# Altium project Hexapod_Board.PrjPcb (part 1 of 2)
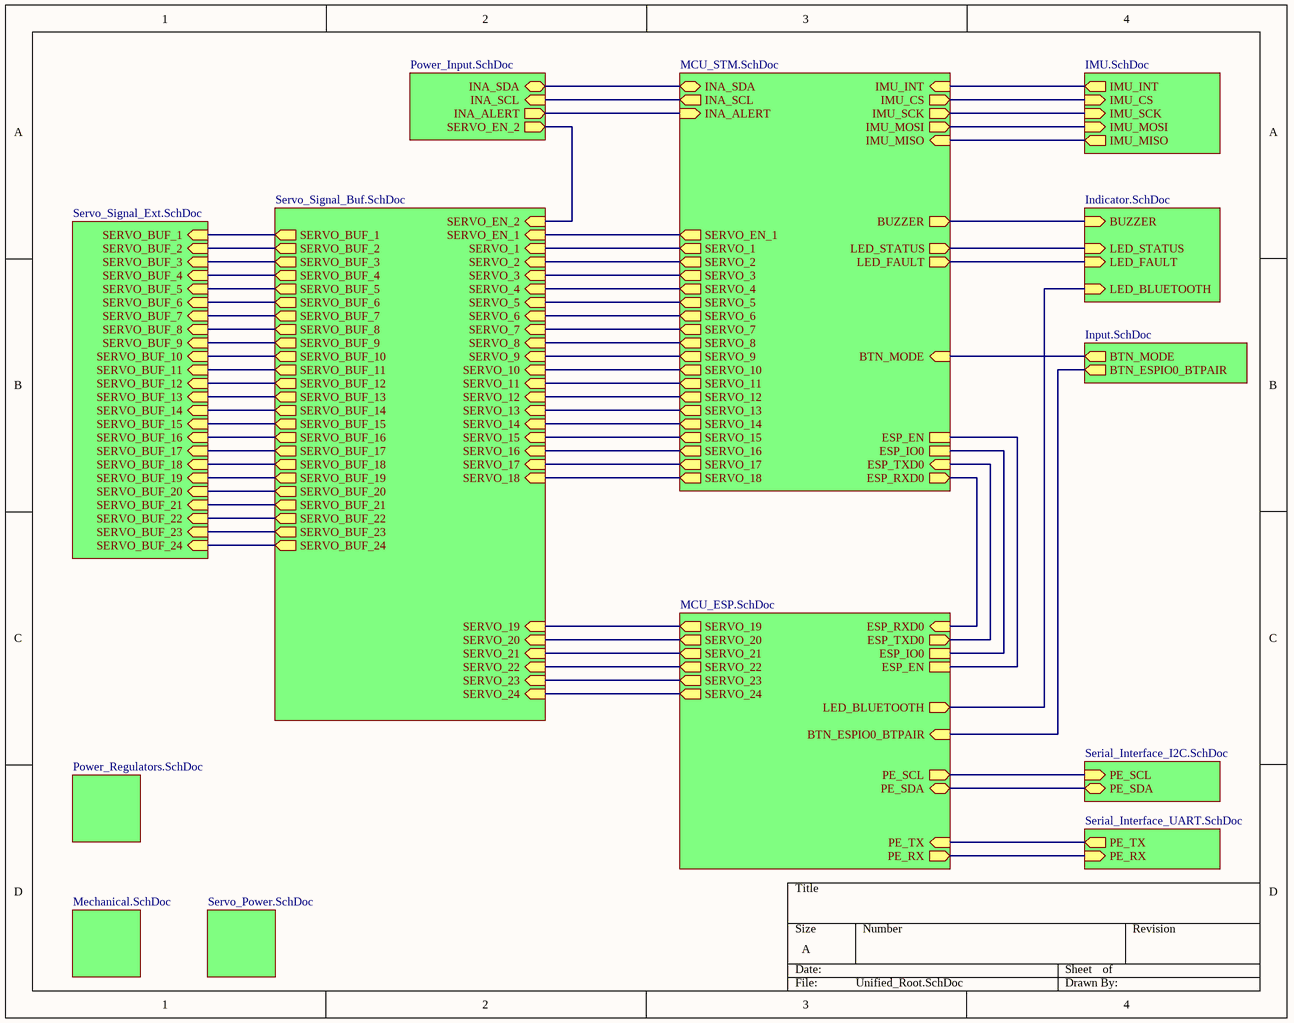
[diagram p0: Unified_Root.SchDoc]
14 sheets, 251 parts. Net scope: hierarchical (ports join the sheet entries above them; power ports are global).
Board file: Hexapod_PCB.PcbDoc
Sheets:
  Unified_Root.SchDoc
    U_MCU_STM = MCU_STM.SchDoc
    U_Indicator = Indicator.SchDoc
    U_Serial_Interface_I2C = Serial_Interface_I2C.SchDoc
    U_Servo_Signal_Buf = Servo_Signal_Buf.SchDoc
    U_Input = Input.SchDoc
    U_Mechanical = Mechanical.SchDoc
    U_MCU_ESP = MCU_ESP.SchDoc
    U_IMU = IMU.SchDoc
    U_Power_Input = Power_Input.SchDoc
    U_Servo_Power = Servo_Power.SchDoc
    U_Power_Regulators = Power_Regulators.SchDoc
    U_Servo_Signal_Ext = Servo_Signal_Ext.SchDoc
    U_Serial_Interface_UART = Serial_Interface_UART.SchDoc

## Sheet Unified_Root.SchDoc
size A; DocumentNumber: 4; SheetNumber: 1; SheetTotal: 14

### Sub-sheets
U_IMU = IMU.SchDoc: IMU_INT (out), IMU_CS (in), IMU_SCK (in), IMU_MOSI (in), IMU_MISO (out)
U_Indicator = Indicator.SchDoc: LED_STATUS (in), LED_FAULT (in), LED_BLUETOOTH (in), BUZZER (in)
U_Input = Input.SchDoc: BTN_ESPIO0_BTPAIR (out), BTN_MODE (out)
U_MCU_ESP = MCU_ESP.SchDoc: SERVO_19 (out), SERVO_20 (out), SERVO_21 (out), SERVO_22 (out), SERVO_23 (out), SERVO_24 (out), ESP_RXD0 (in), ESP_TXD0 (out), ESP_IO0, ESP_EN, PE_SCL (out), PE_SDA (bidir), PE_RX (out), PE_TX (in), BTN_ESPIO0_BTPAIR (in), LED_BLUETOOTH (out)
U_MCU_STM = MCU_STM.SchDoc: SERVO_1 (out), SERVO_2 (out), SERVO_3 (out), SERVO_4 (out), SERVO_5 (out), SERVO_6 (out), SERVO_7 (out), SERVO_8 (out), SERVO_9 (out), SERVO_10 (out), SERVO_11 (out), SERVO_12 (out), SERVO_13 (out), SERVO_14 (out), SERVO_15 (out), SERVO_16 (out), SERVO_17 (out), SERVO_18 (out), SERVO_EN_1 (out), INA_SDA (bidir), INA_SCL (out), INA_ALERT (in), IMU_INT (in), IMU_CS (out), IMU_SCK (out), IMU_MISO (in), IMU_MOSI (out), ESP_IO0, ESP_EN, ESP_RXD0 (out), ESP_TXD0 (in), BUZZER (out), LED_STATUS (out), LED_FAULT (out), BTN_MODE (in)
U_Mechanical = Mechanical.SchDoc: no entries
U_Power_Input = Power_Input.SchDoc: SERVO_EN_2 (out), INA_SCL (in), INA_ALERT (out), INA_SDA (bidir)
U_Power_Regulators = Power_Regulators.SchDoc: no entries
U_Serial_Interface_I2C = Serial_Interface_I2C.SchDoc: PE_SCL (in), PE_SDA (bidir)
U_Serial_Interface_UART = Serial_Interface_UART.SchDoc: PE_TX (out), PE_RX (in)
U_Servo_Power = Servo_Power.SchDoc: no entries
U_Servo_Signal_Buf = Servo_Signal_Buf.SchDoc: SERVO_1 (in), SERVO_2 (in), SERVO_3 (in), SERVO_4 (in), SERVO_5 (in), SERVO_6 (in), SERVO_7 (in), SERVO_8 (in), SERVO_9 (in), SERVO_10 (in), SERVO_11 (in), SERVO_12 (in), SERVO_13 (in), SERVO_14 (in), SERVO_15 (in), SERVO_16 (in), SERVO_17 (in), SERVO_18 (in), SERVO_EN_2 (in), SERVO_EN_1 (in), SERVO_BUF_1 (out), SERVO_BUF_2 (out), SERVO_BUF_3 (out), SERVO_BUF_4 (out), SERVO_BUF_5 (out), SERVO_BUF_6 (out), SERVO_BUF_7 (out), SERVO_BUF_8 (out), SERVO_BUF_9 (out), SERVO_BUF_10 (out), SERVO_BUF_11 (out), SERVO_BUF_12 (out), SERVO_BUF_13 (out), SERVO_BUF_14 (out), SERVO_BUF_15 (out), SERVO_BUF_16 (out), SERVO_BUF_17 (out), SERVO_BUF_18 (out), SERVO_BUF_19 (out), SERVO_BUF_20 (out), SERVO_BUF_21 (out), SERVO_BUF_22 (out), SERVO_BUF_23 (out), SERVO_BUF_24 (out), SERVO_24 (in), SERVO_23 (in), SERVO_22 (in), SERVO_21 (in), SERVO_20 (in), SERVO_19 (in)
U_Servo_Signal_Ext = Servo_Signal_Ext.SchDoc: SERVO_BUF_1 (in), SERVO_BUF_2 (in), SERVO_BUF_3 (in), SERVO_BUF_4 (in), SERVO_BUF_5 (in), SERVO_BUF_6 (in), SERVO_BUF_7 (in), SERVO_BUF_8 (in), SERVO_BUF_9 (in), SERVO_BUF_10 (in), SERVO_BUF_11 (in), SERVO_BUF_12 (in), SERVO_BUF_13 (in), SERVO_BUF_14 (in), SERVO_BUF_15 (in), SERVO_BUF_16 (in), SERVO_BUF_17 (in), SERVO_BUF_18 (in), SERVO_BUF_19 (in), SERVO_BUF_20 (in), SERVO_BUF_21 (in), SERVO_BUF_22 (in), SERVO_BUF_23 (in), SERVO_BUF_24 (in)

### Nets
IO0: sheet U_Input/BTN_ESPIO0_BTPAIR, sheet U_MCU_ESP/BTN_ESPIO0_BTPAIR
NetC78_2: sheet U_MCU_STM/BTN_MODE, sheet U_Input/BTN_MODE
NetD5_1: sheet U_MCU_STM/LED_STATUS, sheet U_Indicator/LED_STATUS
NetD6_1: sheet U_MCU_STM/LED_FAULT, sheet U_Indicator/LED_FAULT
NetD7_1: sheet U_Indicator/LED_BLUETOOTH, sheet U_MCU_ESP/LED_BLUETOOTH
NetR6_1: sheet U_MCU_STM/INA_SCL, sheet U_Power_Input/INA_SCL
NetR7_1: sheet U_MCU_STM/INA_SDA, sheet U_Power_Input/INA_SDA
NetR9_1: sheet U_Servo_Signal_Buf/SERVO_EN_2, sheet U_Power_Input/SERVO_EN_2
NetR11_2: sheet U_MCU_STM/INA_ALERT, sheet U_Power_Input/INA_ALERT
NetR29_2: sheet U_MCU_STM/ESP_EN, sheet U_MCU_ESP/ESP_EN
NetR30_1: sheet U_MCU_STM/ESP_IO0, sheet U_MCU_ESP/ESP_IO0
NetR31_2: sheet U_MCU_STM/ESP_TXD0, sheet U_MCU_ESP/ESP_TXD0
NetR32_2: sheet U_MCU_STM/ESP_RXD0, sheet U_MCU_ESP/ESP_RXD0
NetR35_2: sheet U_Servo_Signal_Buf/SERVO_BUF_6, sheet U_Servo_Signal_Ext/SERVO_BUF_6
NetR36_2: sheet U_Servo_Signal_Buf/SERVO_BUF_3, sheet U_Servo_Signal_Ext/SERVO_BUF_3
NetR37_2: sheet U_Servo_Signal_Buf/SERVO_BUF_7, sheet U_Servo_Signal_Ext/SERVO_BUF_7
NetR38_2: sheet U_Servo_Signal_Buf/SERVO_BUF_4, sheet U_Servo_Signal_Ext/SERVO_BUF_4
NetR39_2: sheet U_Servo_Signal_Buf/SERVO_BUF_8, sheet U_Servo_Signal_Ext/SERVO_BUF_8
NetR40_2: sheet U_Servo_Signal_Buf/SERVO_BUF_5, sheet U_Servo_Signal_Ext/SERVO_BUF_5
NetR41_2: sheet U_Servo_Signal_Buf/SERVO_BUF_16, sheet U_Servo_Signal_Ext/SERVO_BUF_16
NetR42_2: sheet U_Servo_Signal_Buf/SERVO_BUF_13, sheet U_Servo_Signal_Ext/SERVO_BUF_13
NetR43_2: sheet U_Servo_Signal_Buf/SERVO_BUF_1, sheet U_Servo_Signal_Ext/SERVO_BUF_1
NetR44_2: sheet U_Servo_Signal_Buf/SERVO_BUF_14, sheet U_Servo_Signal_Ext/SERVO_BUF_14
NetR45_2: sheet U_Servo_Signal_Buf/SERVO_BUF_2, sheet U_Servo_Signal_Ext/SERVO_BUF_2
NetR46_2: sheet U_Servo_Signal_Buf/SERVO_BUF_15, sheet U_Servo_Signal_Ext/SERVO_BUF_15
NetR47_2: sheet U_Servo_Signal_Buf/SERVO_BUF_10, sheet U_Servo_Signal_Ext/SERVO_BUF_10
NetR48_2: sheet U_Servo_Signal_Buf/SERVO_BUF_17, sheet U_Servo_Signal_Ext/SERVO_BUF_17
NetR49_2: sheet U_Servo_Signal_Buf/SERVO_BUF_11, sheet U_Servo_Signal_Ext/SERVO_BUF_11
NetR50_2: sheet U_Servo_Signal_Buf/SERVO_BUF_18, sheet U_Servo_Signal_Ext/SERVO_BUF_18
NetR51_2: sheet U_Servo_Signal_Buf/SERVO_BUF_12, sheet U_Servo_Signal_Ext/SERVO_BUF_12
NetR52_2: sheet U_Servo_Signal_Buf/SERVO_BUF_19, sheet U_Servo_Signal_Ext/SERVO_BUF_19
NetR53_2: sheet U_Servo_Signal_Buf/SERVO_BUF_20, sheet U_Servo_Signal_Ext/SERVO_BUF_20
NetR54_2: sheet U_Servo_Signal_Buf/SERVO_BUF_23, sheet U_Servo_Signal_Ext/SERVO_BUF_23
NetR55_2: sheet U_Servo_Signal_Buf/SERVO_BUF_21, sheet U_Servo_Signal_Ext/SERVO_BUF_21
NetR56_2: sheet U_Servo_Signal_Buf/SERVO_BUF_24, sheet U_Servo_Signal_Ext/SERVO_BUF_24
NetR57_2: sheet U_Servo_Signal_Buf/SERVO_BUF_22, sheet U_Servo_Signal_Ext/SERVO_BUF_22
NetR58_2: sheet U_Servo_Signal_Buf/SERVO_BUF_9, sheet U_Servo_Signal_Ext/SERVO_BUF_9
NetR78_2: sheet U_MCU_STM/BUZZER, sheet U_Indicator/BUZZER
NetSW4_1: sheet U_MCU_STM/SERVO_EN_1, sheet U_Servo_Signal_Buf/SERVO_EN_1
NetU5_14: sheet U_MCU_STM/SERVO_18, sheet U_Servo_Signal_Buf/SERVO_18
NetU5_15: sheet U_MCU_STM/SERVO_17, sheet U_Servo_Signal_Buf/SERVO_17
NetU5_17: sheet U_MCU_STM/SERVO_16, sheet U_Servo_Signal_Buf/SERVO_16
NetU5_20: sheet U_MCU_STM/IMU_CS, sheet U_IMU/IMU_CS
NetU5_21: sheet U_MCU_STM/IMU_SCK, sheet U_IMU/IMU_SCK
NetU5_22: sheet U_MCU_STM/IMU_MISO, sheet U_IMU/IMU_MISO
NetU5_23: sheet U_MCU_STM/IMU_MOSI, sheet U_IMU/IMU_MOSI
NetU5_24: sheet U_MCU_STM/IMU_INT, sheet U_IMU/IMU_INT
NetU5_26: sheet U_MCU_STM/SERVO_15, sheet U_Servo_Signal_Buf/SERVO_15
NetU5_27: sheet U_MCU_STM/SERVO_14, sheet U_Servo_Signal_Buf/SERVO_14
NetU5_29: sheet U_MCU_STM/SERVO_13, sheet U_Servo_Signal_Buf/SERVO_13
NetU5_41: sheet U_MCU_STM/SERVO_1, sheet U_Servo_Signal_Buf/SERVO_1
NetU5_42: sheet U_MCU_STM/SERVO_2, sheet U_Servo_Signal_Buf/SERVO_2
NetU5_43: sheet U_MCU_STM/SERVO_3, sheet U_Servo_Signal_Buf/SERVO_3
NetU5_44: sheet U_MCU_STM/SERVO_4, sheet U_Servo_Signal_Buf/SERVO_4
NetU5_50: sheet U_MCU_STM/SERVO_5, sheet U_Servo_Signal_Buf/SERVO_5
NetU5_55: sheet U_MCU_STM/SERVO_6, sheet U_Servo_Signal_Buf/SERVO_6
NetU5_56: sheet U_MCU_STM/SERVO_7, sheet U_Servo_Signal_Buf/SERVO_7
NetU5_57: sheet U_MCU_STM/SERVO_8, sheet U_Servo_Signal_Buf/SERVO_8
NetU5_58: sheet U_MCU_STM/SERVO_9, sheet U_Servo_Signal_Buf/SERVO_9
NetU5_59: sheet U_MCU_STM/SERVO_10, sheet U_Servo_Signal_Buf/SERVO_10
NetU5_61: sheet U_MCU_STM/SERVO_11, sheet U_Servo_Signal_Buf/SERVO_11
NetU5_62: sheet U_MCU_STM/SERVO_12, sheet U_Servo_Signal_Buf/SERVO_12
NetU7_11: sheet U_Serial_Interface_I2C/PE_SCL, sheet U_MCU_ESP/PE_SCL
NetU7_12: sheet U_Serial_Interface_I2C/PE_SDA, sheet U_MCU_ESP/PE_SDA
NetU7_13: sheet U_MCU_ESP/PE_TX, sheet U_Serial_Interface_UART/PE_TX
NetU7_14: sheet U_MCU_ESP/PE_RX, sheet U_Serial_Interface_UART/PE_RX
NetU7_26: sheet U_Servo_Signal_Buf/SERVO_19, sheet U_MCU_ESP/SERVO_19
NetU7_27: sheet U_Servo_Signal_Buf/SERVO_20, sheet U_MCU_ESP/SERVO_20
NetU7_28: sheet U_Servo_Signal_Buf/SERVO_21, sheet U_MCU_ESP/SERVO_21
NetU7_29: sheet U_Servo_Signal_Buf/SERVO_22, sheet U_MCU_ESP/SERVO_22
NetU7_30: sheet U_Servo_Signal_Buf/SERVO_23, sheet U_MCU_ESP/SERVO_23
NetU7_31: sheet U_Servo_Signal_Buf/SERVO_24, sheet U_MCU_ESP/SERVO_24

## Sheet MCU_STM.SchDoc
size A; DocumentNumber: 3; SheetNumber: 4; SheetTotal: 14
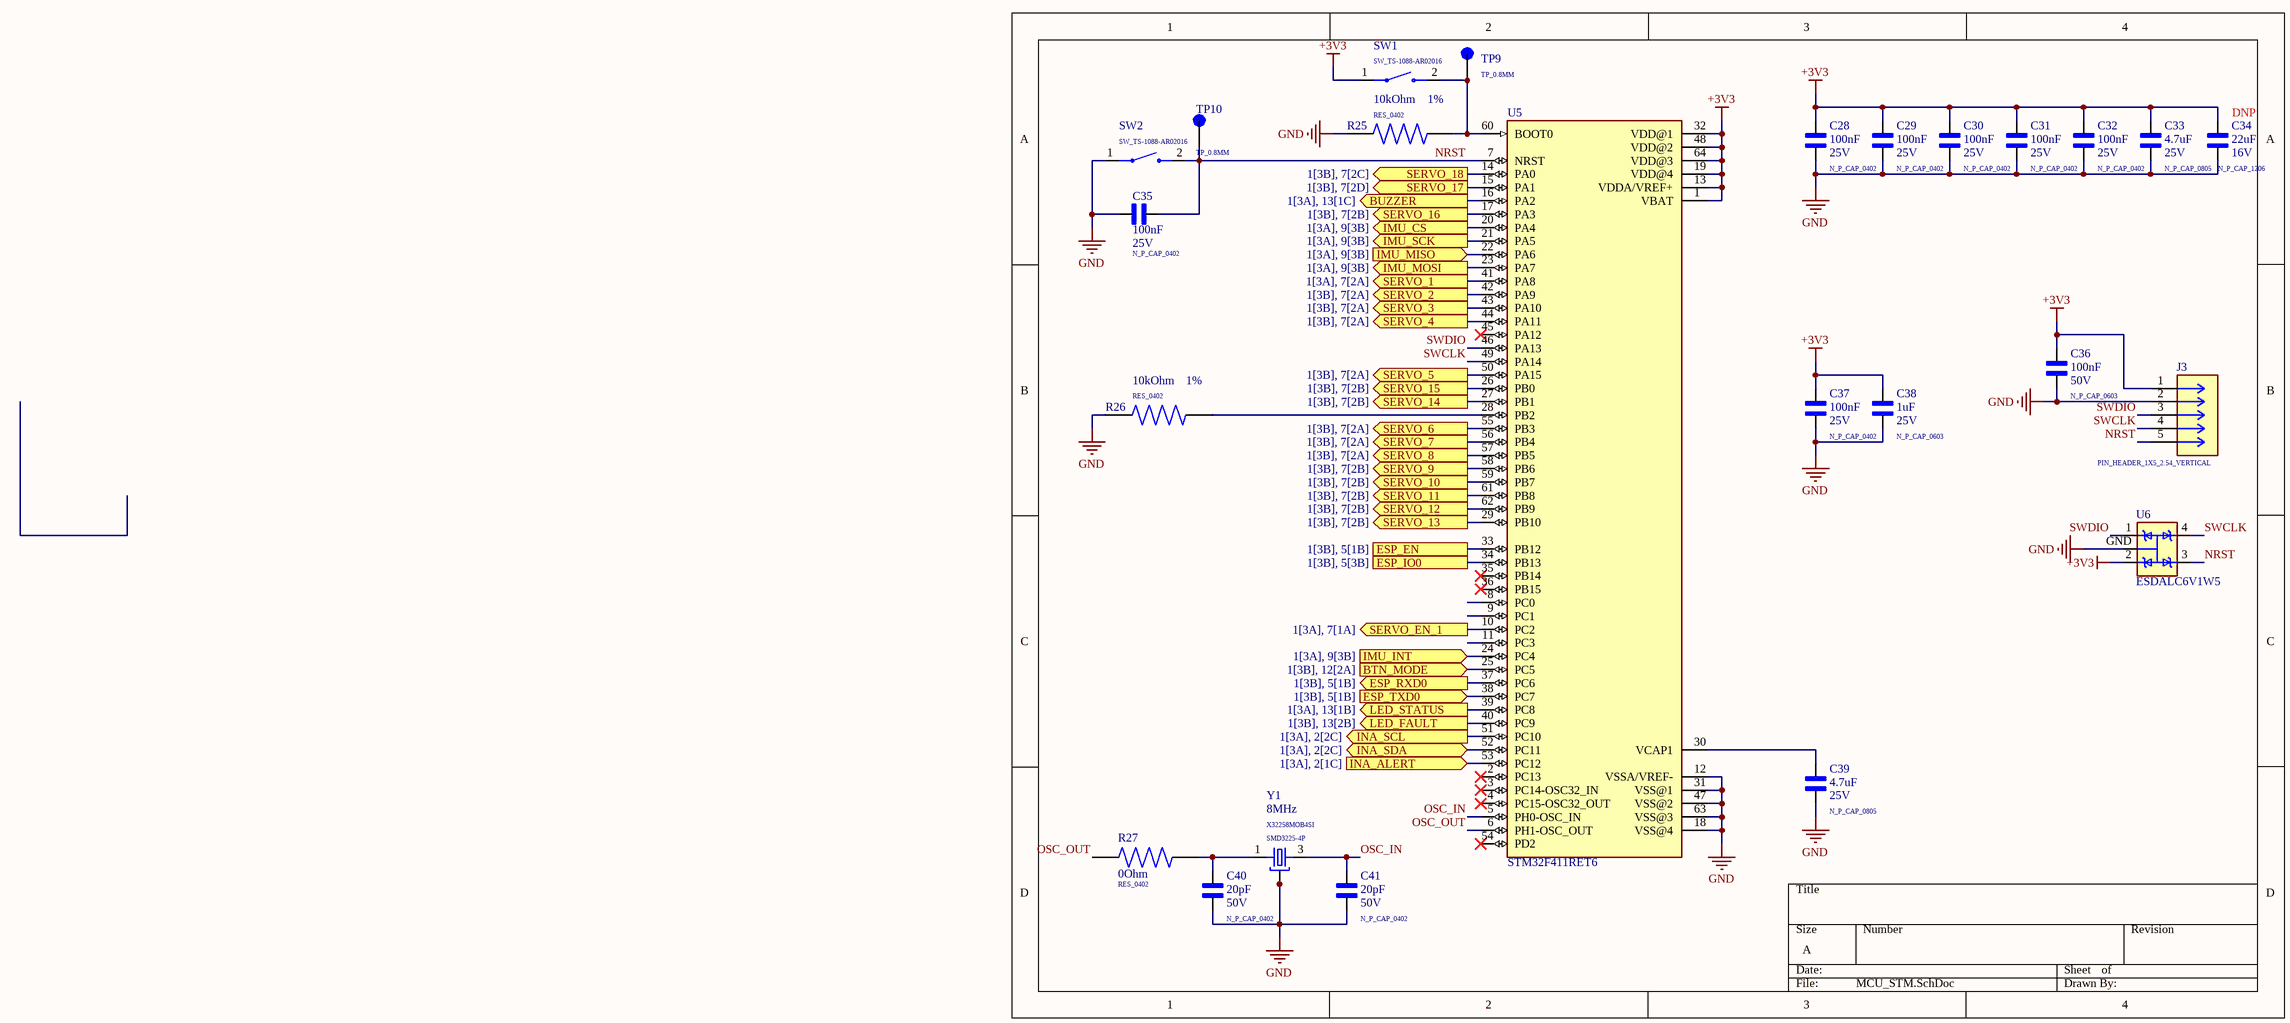
[diagram p1: MCU_STM.SchDoc]

### Parts
C28  N_P_CAP_0402  value 100nF  Rated Voltage: 25V  [N_P_CAP_0402]
C29  N_P_CAP_0402  value 100nF  Rated Voltage: 25V  [N_P_CAP_0402]
C30  N_P_CAP_0402  value 100nF  Rated Voltage: 25V  [N_P_CAP_0402]
C31  N_P_CAP_0402  value 100nF  Rated Voltage: 25V  [N_P_CAP_0402]
C32  N_P_CAP_0402  value 100nF  Rated Voltage: 25V  [N_P_CAP_0402]
C33  N_P_CAP_0805  value 4.7uF  Rated Voltage: 25V  [N_P_CAP_0805]
C34  N_P_CAP_1206  value 22uF  Rated Voltage: 16V  [N_P_CAP_1206]
C35  N_P_CAP_0402  value 100nF  Rated Voltage: 25V  [N_P_CAP_0402]
C36  N_P_CAP_0603  value 100nF  Rated Voltage: 50V  [N_P_CAP_0603]
C37  N_P_CAP_0402  value 100nF  Rated Voltage: 25V  [N_P_CAP_0402]
C38  N_P_CAP_0603  value 1uF  Rated Voltage: 25V  [N_P_CAP_0603]
C39  N_P_CAP_0805  value 4.7uF  Rated Voltage: 25V  [N_P_CAP_0805]
C40  N_P_CAP_0402  value 20pF  Rated Voltage: 50V  [N_P_CAP_0402]
C41  N_P_CAP_0402  value 20pF  Rated Voltage: 50V  [N_P_CAP_0402]
J3  PIN_HEADER_1X5_2.54_VERTICAL  [PIN_HEADER_1X5_2.54_VERTICAL]
R25  RES_0402  value 10kOhm  Tolerance: 1%  [RES_0402]
R26  RES_0402  value 10kOhm  Tolerance: 1%  [RES_0402]
R27  RES_0402  value 0Ohm  [RES_0402]
SW1  SW_TS-1088-AR02016  [SW_TS-1088-AR02016]
SW2  SW_TS-1088-AR02016  [SW_TS-1088-AR02016]
TP9  TP_0.8MM  [TP_0.8MM]
TP10  TP_0.8MM  [TP_0.8MM]
U5  STM32F411RET6  [QFP50P1200X1200X160-64N]
U6  ESDALC6V1W5  [SOT323-5L]
Y1  SMD3225-4P  Frequency: 8MHz  MPN: X32258MOB4SI  [SMD3225-4P]

### Ports
BTN_MODE (in, see 1[3B], 12[2A]), BUZZER (out, see 1[3A], 13[1C]), ESP_EN (see 1[3B], 5[1B]), ESP_IO0 (see 1[3B], 5[3B]), ESP_RXD0 (out, see 1[3B], 5[1B]), ESP_TXD0 (in, see 1[3B], 5[1B]), IMU_CS (out, see 1[3A], 9[3B]), IMU_INT (in, see 1[3A], 9[3B]), IMU_MISO (in, see 1[3A], 9[3B]), IMU_MOSI (out, see 1[3A], 9[3B]), IMU_SCK (out, see 1[3A], 9[3B]), INA_ALERT (in, see 1[3A], 2[1C]), INA_SCL (out, see 1[3A], 2[2C]), INA_SDA (bidir, see 1[3A], 2[2C]), LED_FAULT (out, see 1[3B], 13[2B]), LED_STATUS (out, see 1[3A], 13[1B]), SERVO_1 (out, see 1[3A], 7[2A]), SERVO_2 (out, see 1[3B], 7[2A]), SERVO_3 (out, see 1[3B], 7[2A]), SERVO_4 (out, see 1[3B], 7[2A]), SERVO_5 (out, see 1[3B], 7[2A]), SERVO_6 (out, see 1[3B], 7[2A]), SERVO_7 (out, see 1[3B], 7[2A]), SERVO_8 (out, see 1[3B], 7[2A]), SERVO_9 (out, see 1[3B], 7[2B]), SERVO_10 (out, see 1[3B], 7[2B]), SERVO_11 (out, see 1[3B], 7[2B]), SERVO_12 (out, see 1[3B], 7[2B]), SERVO_13 (out, see 1[3B], 7[2B]), SERVO_14 (out, see 1[3B], 7[2B]), SERVO_15 (out, see 1[3B], 7[2B]), SERVO_16 (out, see 1[3B], 7[2B]), SERVO_17 (out, see 1[3B], 7[2D]), SERVO_18 (out, see 1[3B], 7[2C]), SERVO_EN_1 (out, see 1[3A], 7[1A])

### Nets
+3V3: C28.2 C29.2 C30.2 C31.2 C32.2 C33.2 C34.2 C36.2 C37.2 C38.2 J3.1 SW1.1 U5.1(VBAT) U5.13(VDDA/VREF+) U5.19(VDD@4) U5.32(VDD@1) U5.48(VDD@2) U5.64(VDD@3) U6.2(I/02)
GND: C28.1 C29.1 C30.1 C31.1 C32.1 C33.1 C34.1 C35.1 C36.1 C37.1 C38.1 C39.1 C40.1 C41.1 J3.2 R25.2 R26.2 SW2.1 U5.12(VSSA/VREF-) U5.18(VSS@4) U5.31(VSS@1) U5.47(VSS@2) U5.63(VSS@3) U6.GND Y1.2(GND) Y1.4(GND)
NRST: C35.2 J3.5 SW2.2 TP10.TP U5.7(NRST) U6.3(I/03)
OSC_IN: C41.2 U5.5(PH0-OSC_IN) Y1.3
OSC_OUT: R27.2 U5.6(PH1-OSC_OUT)
SWCLK: J3.4 U5.49(PA14) U6.4(I/04)
SWDIO: J3.3 U5.46(PA13) U6.1(I/01)
NetC39_2: C39.2 U5.30(VCAP1)
NetC40_2: C40.2 R27.1 Y1.1
NetC78_2: U5.25(PC5) ; port BTN_MODE
NetD5_1: U5.39(PC8) ; port LED_STATUS
NetD6_1: U5.40(PC9) ; port LED_FAULT
NetR6_1: U5.51(PC10) ; port INA_SCL
NetR7_1: U5.52(PC11) ; port INA_SDA
NetR11_2: U5.53(PC12) ; port INA_ALERT
NetR25_1: R25.1 SW1.2 TP9.TP U5.60(BOOT0)
NetR26_1: R26.1 U5.28(PB2)
NetR29_2: U5.33(PB12) ; port ESP_EN
NetR30_1: U5.34(PB13) ; port ESP_IO0
NetR31_2: U5.38(PC7) ; port ESP_TXD0
NetR32_2: U5.37(PC6) ; port ESP_RXD0
NetR78_2: U5.16(PA2) ; port BUZZER
NetSW4_1: U5.10(PC2) ; port SERVO_EN_1
NetU5_14: U5.14(PA0) ; port SERVO_18
NetU5_15: U5.15(PA1) ; port SERVO_17
NetU5_17: U5.17(PA3) ; port SERVO_16
NetU5_20: U5.20(PA4) ; port IMU_CS
NetU5_21: U5.21(PA5) ; port IMU_SCK
NetU5_22: U5.22(PA6) ; port IMU_MISO
NetU5_23: U5.23(PA7) ; port IMU_MOSI
NetU5_24: U5.24(PC4) ; port IMU_INT
NetU5_26: U5.26(PB0) ; port SERVO_15
NetU5_27: U5.27(PB1) ; port SERVO_14
NetU5_29: U5.29(PB10) ; port SERVO_13
NetU5_41: U5.41(PA8) ; port SERVO_1
NetU5_42: U5.42(PA9) ; port SERVO_2
NetU5_43: U5.43(PA10) ; port SERVO_3
NetU5_44: U5.44(PA11) ; port SERVO_4
NetU5_50: U5.50(PA15) ; port SERVO_5
NetU5_55: U5.55(PB3) ; port SERVO_6
NetU5_56: U5.56(PB4) ; port SERVO_7
NetU5_57: U5.57(PB5) ; port SERVO_8
NetU5_58: U5.58(PB6) ; port SERVO_9
NetU5_59: U5.59(PB7) ; port SERVO_10
NetU5_61: U5.61(PB8) ; port SERVO_11
NetU5_62: U5.62(PB9) ; port SERVO_12

Not connected (* = marked no-connect by the designer): U5 2(PC13)* 3(PC14-OSC32_IN)* 4(PC15-OSC32_OUT)* 8(PC0) 9(PC1) 11(PC3) 35(PB14)* 36(PB15)* 45(PA12)* 54(PD2)*

### Notes on the sheet
- (near C34) DNP

### Library data of the parts
C28-C32 C35 C37 = N_P_CAP: GENERIC NON-POLARIZED CAP; Temperature Coefficient: X7R; LCSC Part Number: C105883; Tolerance: *; MF: *; ESR: *; MPN: *
C33 C36 C38 C39 = N_P_CAP: GENERIC NON-POLARIZED CAP; Tolerance: *; MF: *; ESR: *; MPN: *; Temperature Coefficient: *
  C33 C39: LCSC Part Number: C354262
  C36: LCSC Part Number: C106221
  C38: LCSC Part Number: C106858
C34 = N_P_CAP: GENERIC NON-POLARIZED CAP; MPN: CL31A226KOHNNNE; Tolerance: 10%; LCSC Part Number: C90146; MF: *; ESR: *; Temperature Coefficient: *
C40 C41 = N_P_CAP: GENERIC NON-POLARIZED CAP; Temperature Coefficient: NP0; LCSC Part Number: C107000; Tolerance: *; MF: *; ESR: *; MPN: *
J3 = PIN_HEADER_5P: GENERIC PIN HEADER 5P; MF: *; MPN: *; LCSC Part Number: *
R25 R26 = RES: GENERIC RES; Power Rating: *; MPN: *; Rated Voltage: *; Temperature Coefficient: *; LCSC Part Number: C60490
R27 = RES: GENERIC RES; Tolerance: 1%; Power Rating: *; MPN: *; Rated Voltage: *; Temperature Coefficient: *; LCSC Part Number: C106231
SW1 SW2 = TACTILE_SWITCH_NO_SPST_2P: GENERIC TACTILE SWITCH NO SPST 2P; MF: *; MPN: *; LCSC Part Number: *
TP9 TP10 = TEST_POINT: GENERIC TEST POINT; MF: *; MPN: *
U5 = STM32F411RET6: ARM Cortex-M4 STM32F4 Microcontroller IC 32-Bit 100MHz 512KB (512K x 8) FLASH 64-LQFP (10x10); MF: STMicroelectronics; Package: LQFP-64 STMicroelectronics; MPN: STM32F411RET6; LCSC Part Number: C94355
U6 = ESDALC6V1W5: Clamp Ipp Tvs Diode Surface Mount SOT-323-5; MF: STMicroelectronics; Package: SOT-323 STMicroelectronics; MPN: ESDALC6V1W5; LCSC Part Number: C703691
Y1 = XTAL_4P: GENERIC PASSIVE CRYSTAL; MF: YXC Crystal Oscillators; ESR: *; LCSC Part Number: C2682775; Load Capacitance: *; Frequency Tolerance: *

## Sheet Indicator.SchDoc
size A; DocumentNumber: 13; SheetNumber: 13; SheetTotal: 14
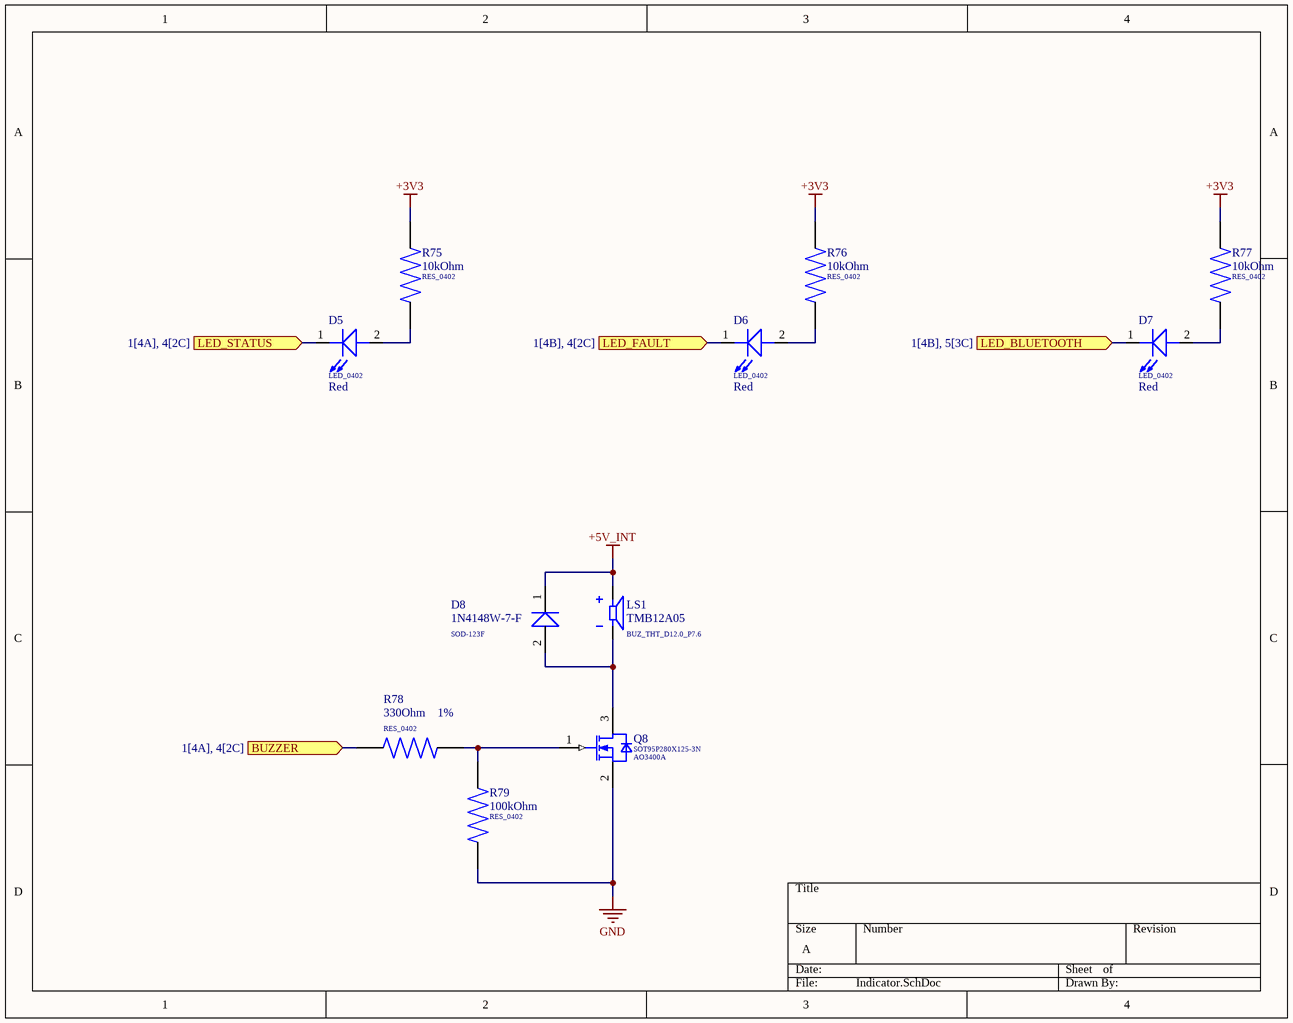
[diagram p2: Indicator.SchDoc]

### Parts
D5  LED_0402  Color: Red  [LED_0402]
D6  LED_0402  Color: Red  [LED_0402]
D7  LED_0402  Color: Red  [LED_0402]
D8  SOD-123F  MPN: 1N4148W-7-F  [SOD-123F]
LS1  BUZ_THT_D12.0_P7.6  MPN: TMB12A05  [BUZ_THT_D12.0_P7.6]
Q8  SOT95P280X125-3N  MPN: AO3400A  [SOT95P280X125-3N]
R75  RES_0402  value 10kOhm  [RES_0402]
R76  RES_0402  value 10kOhm  [RES_0402]
R77  RES_0402  value 10kOhm  [RES_0402]
R78  RES_0402  value 330Ohm  Tolerance: 1%  [RES_0402]
R79  RES_0402  value 100kOhm  [RES_0402]

### Ports
BUZZER (in, see 1[4A], 4[2C]), LED_BLUETOOTH (in, see 1[4B], 5[3C]), LED_FAULT (in, see 1[4B], 4[2C]), LED_STATUS (in, see 1[4A], 4[2C])

### Nets
+3V3: R75.1 R76.1 R77.1
+5V_INT: D8.1(K) LS1.P
GND: Q8.2(SOURCE) R79.1
NetD5_1: D5.1(K) ; port LED_STATUS
NetD5_2: D5.2(A) R75.2
NetD6_1: D6.1(K) ; port LED_FAULT
NetD6_2: D6.2(A) R76.2
NetD7_1: D7.1(K) ; port LED_BLUETOOTH
NetD7_2: D7.2(A) R77.2
NetD8_2: D8.2(A) LS1.N Q8.3(DRAIN)
NetQ8_1: Q8.1(GATE) R78.1 R79.2
NetR78_2: R78.2 ; port BUZZER

### Library data of the parts
D5-D7 = LED: GENERIC LED; MPN: *; Vf (Typ): *; Package: *; LCSC Part Number: C25503345; If (Max): *; MF: *
D8 = DIODE: GENERIC DIODE; Pd (Max): *; LCSC Part Number: C83528; Vf (Max): *; If (Avg): *; Vr (Max): *; MF: *
LS1 = BUZZER: GENERIC BUZZER; SPL: 85dB; MF: *; Type: Active Buzzer; LCSC Part Number: C96093
Q8 = NMOS_GSD: GENERIC N-MOSFET 1=G, 2=S, 3=D; Channel Type: P-Channel; LCSC Part Number: C20917; Vds (Max): *; Id (Max): *; Vgs(th): *; MF: *; Rds(on) (Max): *
R75-R77 R79 = RES: GENERIC RES; Tolerance: 1%; Power Rating: *; MPN: *; Rated Voltage: *; Temperature Coefficient: *
  R75-R77: LCSC Part Number: C60490
  R79: LCSC Part Number: C60491
R78 = RES: GENERIC RES; MPN: RC0402FR-07330RL; Power Rating: *; Rated Voltage: *; Temperature Coefficient: *; LCSC Part Number: C105875

## Sheet Serial_Interface_I2C.SchDoc
size A; DocumentNumber: 10; SheetNumber: 10; SheetTotal: 14
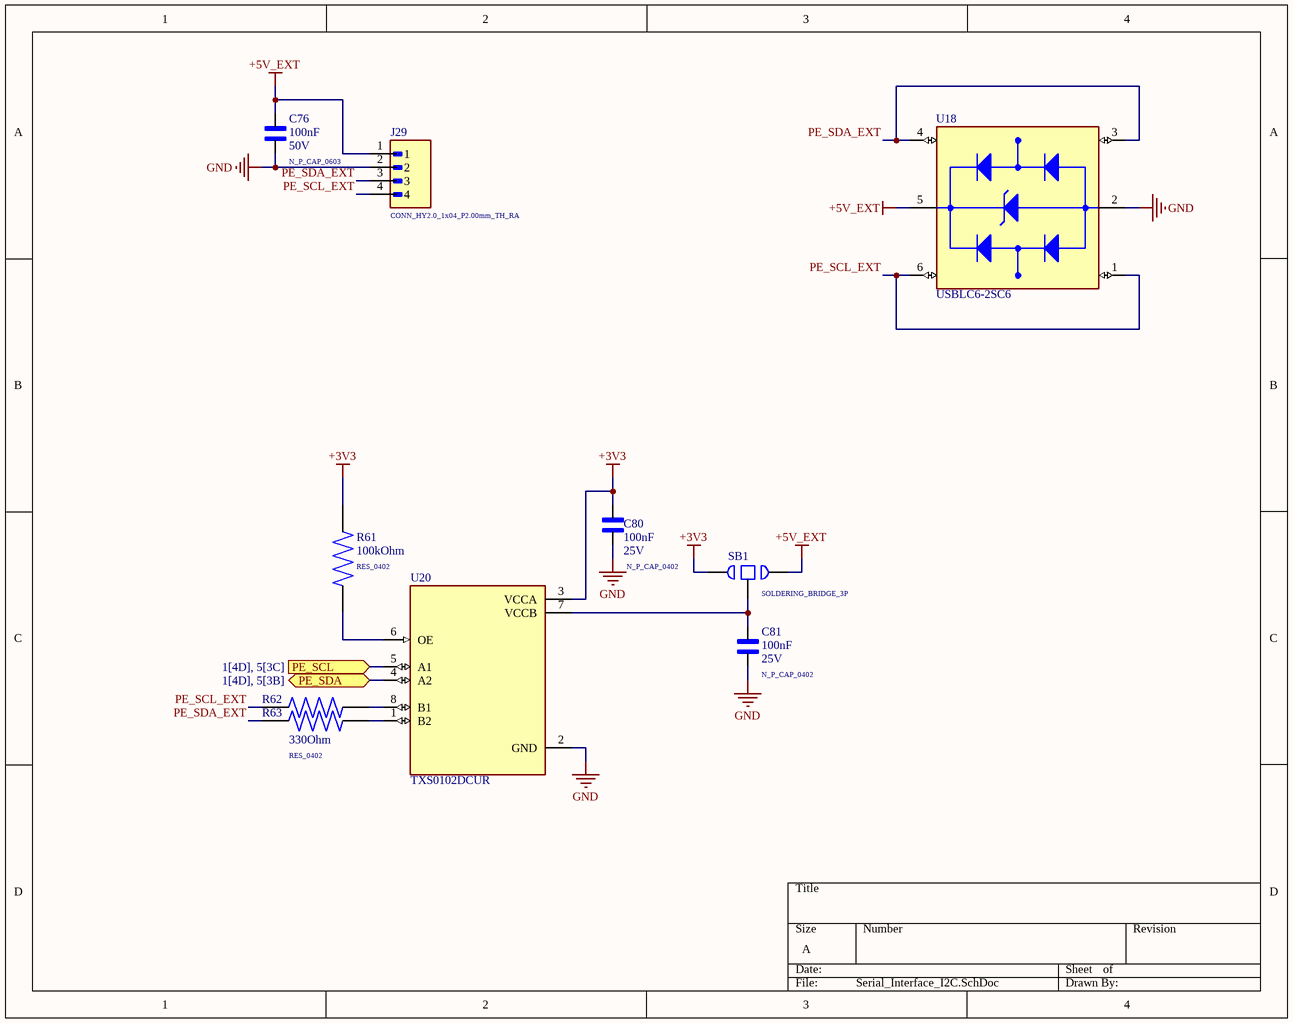
[diagram p3: Serial_Interface_I2C.SchDoc]

### Parts
C76  N_P_CAP_0603  value 100nF  Rated Voltage: 50V  [N_P_CAP_0603]
C80  N_P_CAP_0402  value 100nF  Rated Voltage: 25V  [N_P_CAP_0402]
C81  N_P_CAP_0402  value 100nF  Rated Voltage: 25V  [N_P_CAP_0402]
J29  CONN_HY2.0_1x04_P2.00mm_TH_RA  [CONN_HY2.0_1x04_P2.00mm_TH_RA]
R61  RES_0402  value 100kOhm  [RES_0402]
R62  RES_0402  [RES_0402]  (value not drawn)
R63  RES_0402  value 330Ohm  [RES_0402]
SB1  SOLDERING_BRIDGE_3P  [SOLDERING_BRIDGE_3P]  (no BOM)
U18  USBLC6-2SC6  [SOT95P280X145-6N]
U20  TXS0102DCUR  [SOP50P310X90-8N]

### Ports
PE_SCL (in, see 1[4D], 5[3C]), PE_SDA (bidir, see 1[4D], 5[3B])

### Nets
+3V3: C80.2 R61.1 SB1.1 U20.3(VCCA)
+5V_EXT: C76.2 J29.1 SB1.2 U18.5(VBUS)
GND: C76.1 C80.1 C81.1 J29.2 U18.2(GND) U20.2(GND)
PE_SCL_EXT: J29.4 R62.2 U18.1(I/O1_IN) U18.6(I/O1_OUT)
PE_SDA_EXT: J29.3 R63.1 U18.3(I/O2_IN) U18.4(I/O2_OUT)
NetC81_2: C81.2 SB1.3 U20.7(VCCB)
NetR61_2: R61.2 U20.6(OE)
NetR62_1: R62.1 U20.8(B1)
NetR63_2: R63.2 U20.1(B2)
NetU7_11: U20.5(A1) ; port PE_SCL
NetU7_12: U20.4(A2) ; port PE_SDA

### Library data of the parts
C76 = N_P_CAP: GENERIC NON-POLARIZED CAP; LCSC Part Number: C106221; Tolerance: *; MF: *; ESR: *; MPN: *; Temperature Coefficient: *
C80 C81 = N_P_CAP: as C28 on sheet MCU_STM; LCSC Part Number: C105883; Tolerance: *; MF: *; ESR: *; MPN: *
J29 = CONN_4P: GENERIC CONNECTOR 4P; MF: *; MPN: *; LCSC Part Number: C55381784
R61 = RES: GENERIC RES; Tolerance: 1%; Power Rating: *; MPN: *; Rated Voltage: *; Temperature Coefficient: *; LCSC Part Number: C60491
R62 = RES: GENERIC RES; MPN: RC0402FR-07330RL; Tolerance: 1%; Value: 330Ohm; Power Rating: *; Rated Voltage: *; Temperature Coefficient: *; LCSC Part Number: C105875
R63 = RES: GENERIC RES; MPN: RC0402FR-07330RL; Tolerance: 1%; Power Rating: *; Rated Voltage: *; Temperature Coefficient: *; LCSC Part Number: C105875
SB1 = SOLDERING_BRIDGE_3P: GENERIC SOLDERING BRIDGE 3P
U18 = USBLC6-2SC6: 17V Clamp 5A (8/20Âµs) Ipp Tvs Diode Surface Mount SOT-23-6; MF: STMicroelectronics; Package: SOT-23-6 STMicroelectronics; MPN: USBLC6-2SC6; LCSC Part Number: C7519
U20 = TXS0102DCUR: 2-Bit Bidirectional Voltage-Level Shifter for Open-Drain and Push-Pull Application; MF: Texas Instruments; Package: VSSOP-8 Texas Instruments; MPN: TXS0102DCUR

## Sheet Servo_Signal_Buf.SchDoc
size A; DocumentNumber: 7; SheetNumber: 7; SheetTotal: 14
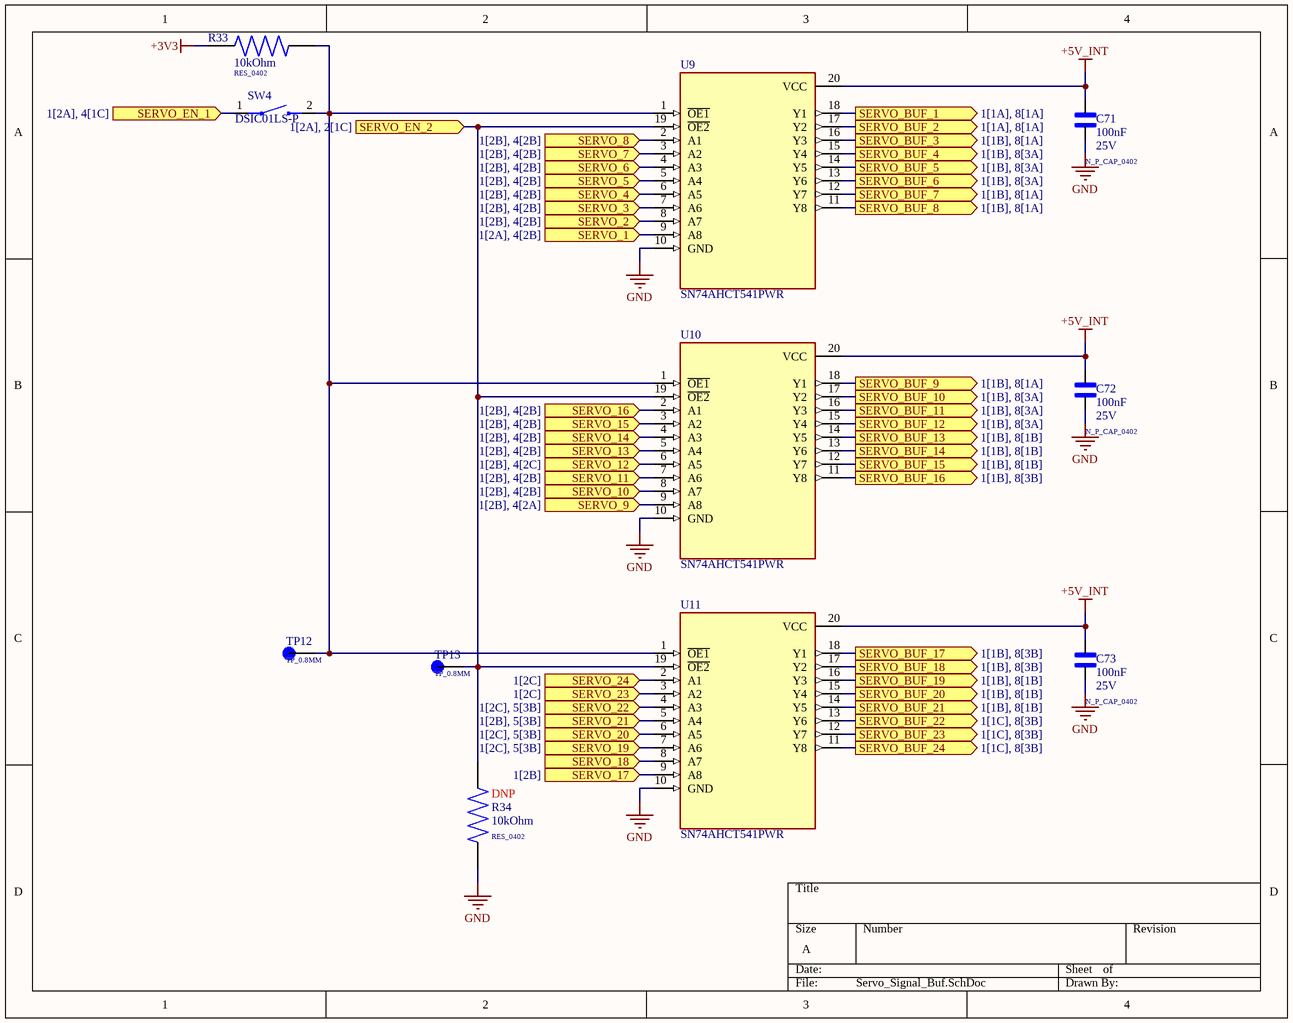
[diagram p4: Servo_Signal_Buf.SchDoc]

### Parts
C71  N_P_CAP_0402  value 100nF  Rated Voltage: 25V  [N_P_CAP_0402]
C72  N_P_CAP_0402  value 100nF  Rated Voltage: 25V  [N_P_CAP_0402]
C73  N_P_CAP_0402  value 100nF  Rated Voltage: 25V  [N_P_CAP_0402]
R33  RES_0402  value 10kOhm  [RES_0402]
R34  RES_0402  value 10kOhm  [RES_0402]
SW4  MPN: DSIC01LS-P  [SW_KAE01SGGT]  (hidden comment: SW_KAE01SGGT)
TP12  TP_0.8MM  [TP_0.8MM]
TP13  TP_0.8MM  [TP_0.8MM]
U9  SN74AHCT541PWR  [SOP65P640X120-20N]
U10  SN74AHCT541PWR  [SOP65P640X120-20N]
U11  SN74AHCT541PWR  [SOP65P640X120-20N]

### Ports
SERVO_1 (in, see 1[2A], 4[2B]), SERVO_2 (in, see 1[2B], 4[2B]), SERVO_3 (in, see 1[2B], 4[2B]), SERVO_4 (in, see 1[2B], 4[2B]), SERVO_5 (in, see 1[2B], 4[2B]), SERVO_6 (in, see 1[2B], 4[2B]), SERVO_7 (in, see 1[2B], 4[2B]), SERVO_8 (in, see 1[2B], 4[2B]), SERVO_9 (in, see 1[2B], 4[2A]), SERVO_10 (in, see 1[2B], 4[2B]), SERVO_11 (in, see 1[2B], 4[2B]), SERVO_12 (in, see 1[2B], 4[2C]), SERVO_13 (in, see 1[2B], 4[2B]), SERVO_14 (in, see 1[2B], 4[2B]), SERVO_15 (in, see 1[2B], 4[2B]), SERVO_16 (in, see 1[2B], 4[2B]), SERVO_17 (in, see 1[2B]), SERVO_18 (in), SERVO_19 (in, see 1[2C], 5[3B]), SERVO_20 (in, see 1[2C], 5[3B]), SERVO_21 (in, see 1[2B], 5[3B]), SERVO_22 (in, see 1[2C], 5[3B]), SERVO_23 (in, see 1[2C]), SERVO_24 (in, see 1[2C]), SERVO_BUF_1 (out, see 1[1A], 8[1A]), SERVO_BUF_2 (out, see 1[1A], 8[1A]), SERVO_BUF_3 (out, see 1[1B], 8[1A]), SERVO_BUF_4 (out, see 1[1B], 8[3A]), SERVO_BUF_5 (out, see 1[1B], 8[3A]), SERVO_BUF_6 (out, see 1[1B], 8[3A]), SERVO_BUF_7 (out, see 1[1B], 8[1A]), SERVO_BUF_8 (out, see 1[1B], 8[1A]), SERVO_BUF_9 (out, see 1[1B], 8[1A]), SERVO_BUF_10 (out, see 1[1B], 8[3A]), SERVO_BUF_11 (out, see 1[1B], 8[3A]), SERVO_BUF_12 (out, see 1[1B], 8[3A]), SERVO_BUF_13 (out, see 1[1B], 8[1B]), SERVO_BUF_14 (out, see 1[1B], 8[1B]), SERVO_BUF_15 (out, see 1[1B], 8[1B]), SERVO_BUF_16 (out, see 1[1B], 8[3B]), SERVO_BUF_17 (out, see 1[1B], 8[3B]), SERVO_BUF_18 (out, see 1[1B], 8[3B]), SERVO_BUF_19 (out, see 1[1B], 8[1B]), SERVO_BUF_20 (out, see 1[1B], 8[1B]), SERVO_BUF_21 (out, see 1[1B], 8[1B]), SERVO_BUF_22 (out, see 1[1C], 8[3B]), SERVO_BUF_23 (out, see 1[1C], 8[3B]), SERVO_BUF_24 (out, see 1[1C], 8[3B]), SERVO_EN_1 (in, see 1[2A], 4[1C]), SERVO_EN_2 (in, see 1[2A], 2[1C])

### Nets
+3V3: R33.1
+5V_INT: C71.2 C72.2 C73.2 U9.20(VCC) U10.20(VCC) U11.20(VCC)
GND: C71.1 C72.1 C73.1 R34.2 U9.10(GND) U10.10(GND) U11.10(GND)
NetR9_1: R34.1 TP13.TP U9.19(~{OE2}) U10.19(~{OE2}) U11.19(~{OE2}) ; port SERVO_EN_2
NetR33_2: R33.2 SW4.2 TP12.TP U9.1(~{OE1}) U10.1(~{OE1}) U11.1(~{OE1})
NetR35_2: U9.13(Y6) ; port SERVO_BUF_6
NetR36_2: U9.16(Y3) ; port SERVO_BUF_3
NetR37_2: U9.12(Y7) ; port SERVO_BUF_7
NetR38_2: U9.15(Y4) ; port SERVO_BUF_4
NetR39_2: U9.11(Y8) ; port SERVO_BUF_8
NetR40_2: U9.14(Y5) ; port SERVO_BUF_5
NetR41_2: U10.11(Y8) ; port SERVO_BUF_16
NetR42_2: U10.14(Y5) ; port SERVO_BUF_13
NetR43_2: U9.18(Y1) ; port SERVO_BUF_1
NetR44_2: U10.13(Y6) ; port SERVO_BUF_14
NetR45_2: U9.17(Y2) ; port SERVO_BUF_2
NetR46_2: U10.12(Y7) ; port SERVO_BUF_15
NetR47_2: U10.17(Y2) ; port SERVO_BUF_10
NetR48_2: U11.18(Y1) ; port SERVO_BUF_17
NetR49_2: U10.16(Y3) ; port SERVO_BUF_11
NetR50_2: U11.17(Y2) ; port SERVO_BUF_18
NetR51_2: U10.15(Y4) ; port SERVO_BUF_12
NetR52_2: U11.16(Y3) ; port SERVO_BUF_19
NetR53_2: U11.15(Y4) ; port SERVO_BUF_20
NetR54_2: U11.12(Y7) ; port SERVO_BUF_23
NetR55_2: U11.14(Y5) ; port SERVO_BUF_21
NetR56_2: U11.11(Y8) ; port SERVO_BUF_24
NetR57_2: U11.13(Y6) ; port SERVO_BUF_22
NetR58_2: U10.18(Y1) ; port SERVO_BUF_9
NetSW4_1: SW4.1 ; port SERVO_EN_1
NetU5_14: U11.8(A7) ; port SERVO_18
NetU5_15: U11.9(A8) ; port SERVO_17
NetU5_17: U10.2(A1) ; port SERVO_16
NetU5_26: U10.3(A2) ; port SERVO_15
NetU5_27: U10.4(A3) ; port SERVO_14
NetU5_29: U10.5(A4) ; port SERVO_13
NetU5_41: U9.9(A8) ; port SERVO_1
NetU5_42: U9.8(A7) ; port SERVO_2
NetU5_43: U9.7(A6) ; port SERVO_3
NetU5_44: U9.6(A5) ; port SERVO_4
NetU5_50: U9.5(A4) ; port SERVO_5
NetU5_55: U9.4(A3) ; port SERVO_6
NetU5_56: U9.3(A2) ; port SERVO_7
NetU5_57: U9.2(A1) ; port SERVO_8
NetU5_58: U10.9(A8) ; port SERVO_9
NetU5_59: U10.8(A7) ; port SERVO_10
NetU5_61: U10.7(A6) ; port SERVO_11
NetU5_62: U10.6(A5) ; port SERVO_12
NetU7_26: U11.7(A6) ; port SERVO_19
NetU7_27: U11.6(A5) ; port SERVO_20
NetU7_28: U11.5(A4) ; port SERVO_21
NetU7_29: U11.4(A3) ; port SERVO_22
NetU7_30: U11.3(A2) ; port SERVO_23
NetU7_31: U11.2(A1) ; port SERVO_24

### Notes on the sheet
- (near R34) DNP

### Library data of the parts
C71-C73 = N_P_CAP: as C28 on sheet MCU_STM; LCSC Part Number: C105883; Tolerance: *; MF: *; ESR: *; MPN: *
R33 R34 = RES: GENERIC RES; Tolerance: 1%; Power Rating: *; MPN: *; Rated Voltage: *; Temperature Coefficient: *; LCSC Part Number: C60490
SW4 = SW_DIP_SPST_1P: GENERIC DIP SWITCH SPST 1 POLE; MF: XKB Connection; LCSC Part Number: C600988
TP12 TP13 = TEST_POINT: GENERIC TEST POINT; MF: *; MPN: *
U9-U11 = SN74AHCT541PWR: Octal Buffers/Drivers With 3-State Outputs 20-TSSOP -40 to 125; MF: Texas Instruments; DigiKey Part Number: 296-1120-1-ND; Package: TSSOP-20 Texas Instruments; MPN: SN74AHCT541PWR; LCSC Part Number: C50989

## Sheet Input.SchDoc
size A; DocumentNumber: 12; SheetNumber: 12; SheetTotal: 14
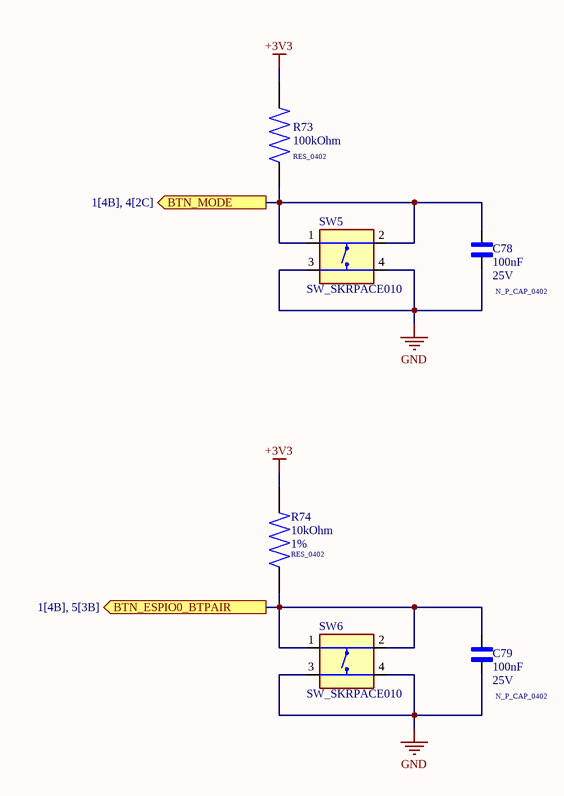
[diagram p5: Input.SchDoc]

### Parts
C78  N_P_CAP_0402  value 100nF  Rated Voltage: 25V  [N_P_CAP_0402]
C79  N_P_CAP_0402  value 100nF  Rated Voltage: 25V  [N_P_CAP_0402]
R73  RES_0402  value 100kOhm  [RES_0402]
R74  RES_0402  value 10kOhm  Tolerance: 1%  [RES_0402]
SW5  SW_SKRPACE010  [SW_SKRPACE010]
SW6  SW_SKRPACE010  [SW_SKRPACE010]

### Ports
BTN_ESPIO0_BTPAIR (out, see 1[4B], 5[3B]), BTN_MODE (out, see 1[4B], 4[2C])

### Nets
+3V3: R73.1 R74.1
GND: C78.1 C79.1 SW5.3 SW5.4 SW6.3 SW6.4
IO0: C79.2 R74.2 SW6.1 SW6.2 ; port BTN_ESPIO0_BTPAIR
NetC78_2: C78.2 R73.2 SW5.1 SW5.2 ; port BTN_MODE

### Library data of the parts
C78 C79 = N_P_CAP: as C28 on sheet MCU_STM; LCSC Part Number: C105883; Tolerance: *; MF: *; ESR: *; MPN: *
R73 = RES: GENERIC RES; Tolerance: 1%; Power Rating: *; MPN: *; Rated Voltage: *; Temperature Coefficient: *; LCSC Part Number: C60491
R74 = RES: GENERIC RES; Power Rating: *; MPN: *; Rated Voltage: *; Temperature Coefficient: *; LCSC Part Number: C60490
SW5 SW6 = TACTILE_SWITCH_NO_SPST_4P: GENERIC TACTILE SWITCH NO SPST 4P; MF: ALPS; MPN: SKRPACE010; LCSC Part Number: C139797

## Sheet Mechanical.SchDoc
size A; DocumentNumber: 14; SheetNumber: 14; SheetTotal: 14
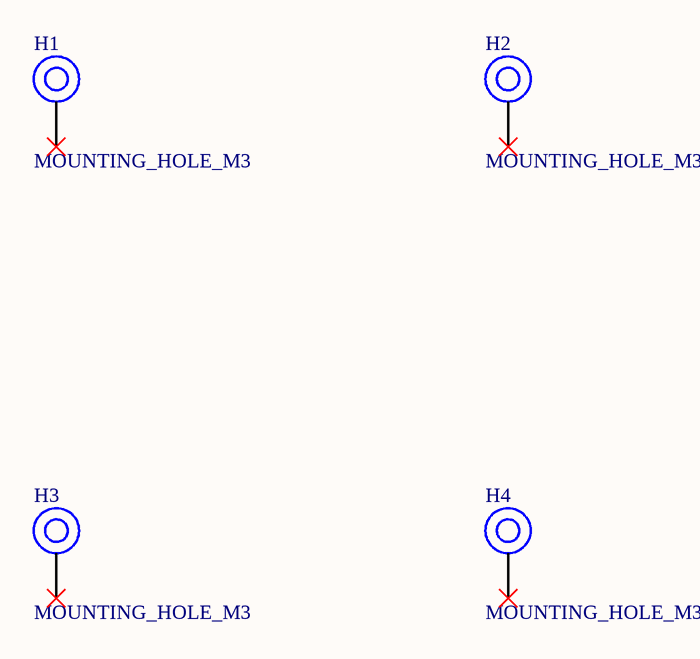
[diagram p6: Mechanical.SchDoc]

### Parts
H1  MOUNTING_HOLE_M3  [MOUNTING_HOLE_M3]  (no BOM)
H2  MOUNTING_HOLE_M3  [MOUNTING_HOLE_M3]  (no BOM)
H3  MOUNTING_HOLE_M3  [MOUNTING_HOLE_M3]  (no BOM)
H4  MOUNTING_HOLE_M3  [MOUNTING_HOLE_M3]  (no BOM)

### Nets

Not connected (* = marked no-connect by the designer): H1 1*; H2 1*; H3 1*; H4 1*

### Library data of the parts
H1-H4 = MOUNTING_HOLE: GENERIC MOUNTING HOLE

## Sheet MCU_ESP.SchDoc
size A; DocumentNumber: 5; SheetNumber: 5; SheetTotal: 14
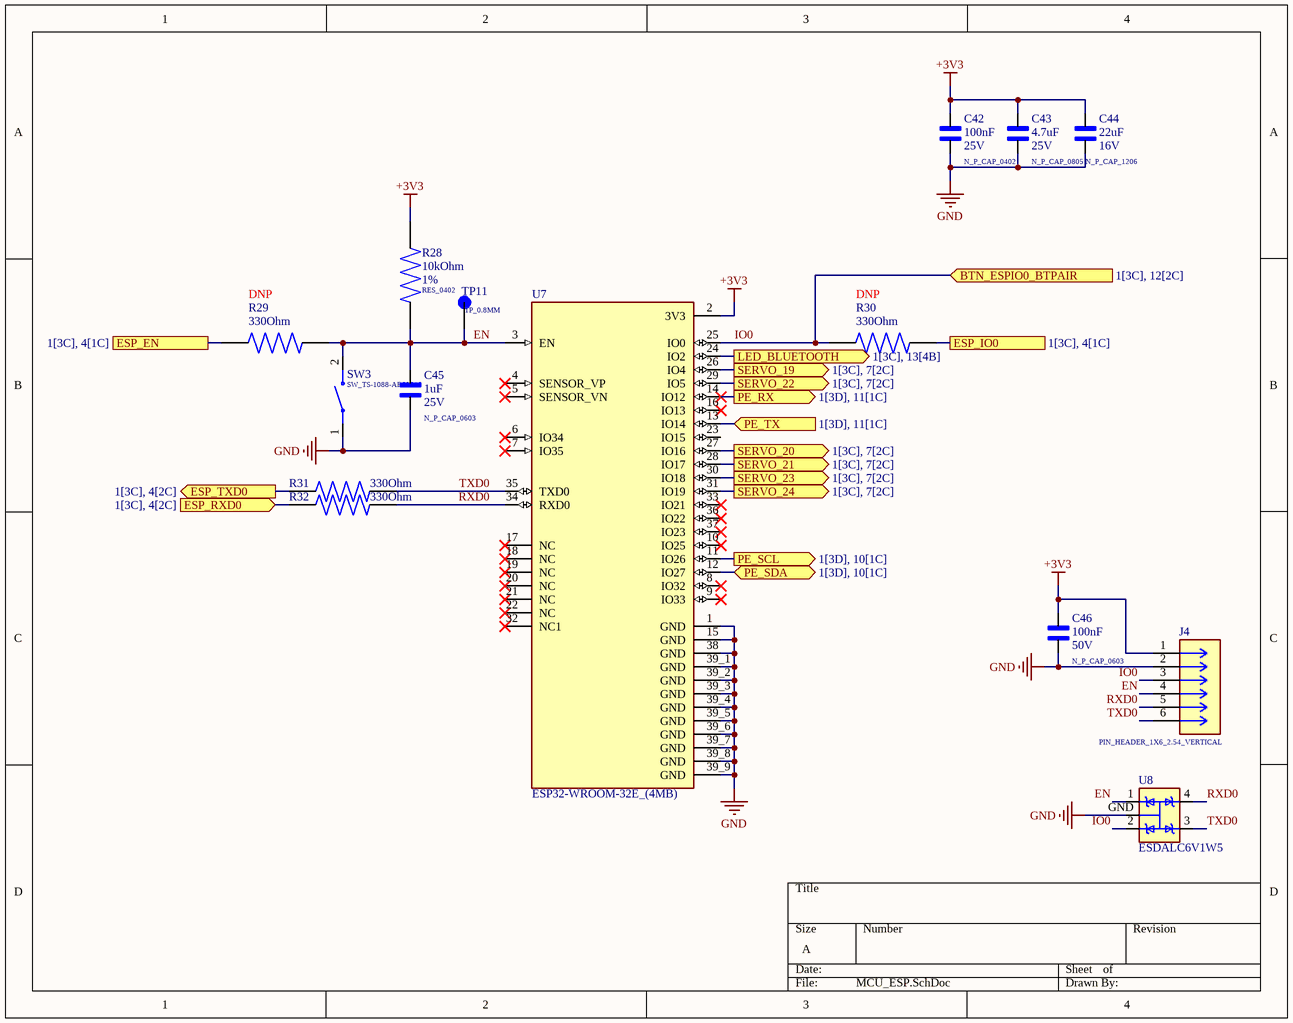
[diagram p7: MCU_ESP.SchDoc]

### Parts
C42  N_P_CAP_0402  value 100nF  Rated Voltage: 25V  [N_P_CAP_0402]
C43  N_P_CAP_0805  value 4.7uF  Rated Voltage: 25V  [N_P_CAP_0805]
C44  N_P_CAP_1206  value 22uF  Rated Voltage: 16V  [N_P_CAP_1206]
C45  N_P_CAP_0603  value 1uF  Rated Voltage: 25V  [N_P_CAP_0603]
C46  N_P_CAP_0603  value 100nF  Rated Voltage: 50V  [N_P_CAP_0603]
J4  PIN_HEADER_1X6_2.54_VERTICAL  [PIN_HEADER_1X6_2.54_VERTICAL]
R28  RES_0402  value 10kOhm  Tolerance: 1%  [RES_0402]
R29  value 330Ohm  [RES_0402]  (hidden comment: RES_0402)
R30  value 330Ohm  [RES_0402]  (hidden comment: RES_0402)
R31  value 330Ohm  [RES_0402]  (hidden comment: RES_0402)
R32  value 330Ohm  [RES_0402]  (hidden comment: RES_0402)
SW3  SW_TS-1088-AR02016  [SW_TS-1088-AR02016]
TP11  TP_0.8MM  [TP_0.8MM]
U7  ESP32-WROOM-32E_(4MB)  [XCVR_ESP32-WROOM-32E_(4MB)]
U8  ESDALC6V1W5  [SOT323-5L]

### Ports
BTN_ESPIO0_BTPAIR (in, see 1[3C], 12[2C]), ESP_EN (see 1[3C], 4[1C]), ESP_IO0 (see 1[3C], 4[1C]), ESP_RXD0 (in, see 1[3C], 4[2C]), ESP_TXD0 (out, see 1[3C], 4[2C]), LED_BLUETOOTH (out, see 1[3C], 13[4B]), PE_RX (out, see 1[3D], 11[1C]), PE_SCL (out, see 1[3D], 10[1C]), PE_SDA (bidir, see 1[3D], 10[1C]), PE_TX (in, see 1[3D], 11[1C]), SERVO_19 (out, see 1[3C], 7[2C]), SERVO_20 (out, see 1[3C], 7[2C]), SERVO_21 (out, see 1[3C], 7[2C]), SERVO_22 (out, see 1[3C], 7[2C]), SERVO_23 (out, see 1[3C], 7[2C]), SERVO_24 (out, see 1[3C], 7[2C])

### Nets
+3V3: C42.2 C43.2 C44.2 C46.2 J4.1 R28.1 U7.2(3V3)
GND: C42.1 C43.1 C44.1 C45.1 C46.1 J4.2 SW3.1 U7.1(GND) U7.15(GND) U7.38(GND) U7.39_1(GND) U7.39_2(GND) U7.39_3(GND) U7.39_4(GND) U7.39_5(GND) U7.39_6(GND) U7.39_7(GND) U7.39_8(GND) U7.39_9(GND) U8.GND
EN: C45.2 J4.4 R28.2 R29.1 SW3.2 TP11.TP U7.3(EN) U8.1(I/01)
IO0: J4.3 R30.2 U7.25(IO0) U8.2(I/02) ; port BTN_ESPIO0_BTPAIR
RXD0: J4.5 R32.1 U7.34(RXD0) U8.4(I/04)
TXD0: J4.6 R31.1 U7.35(TXD0) U8.3(I/03)
NetD7_1: U7.24(IO2) ; port LED_BLUETOOTH
NetR29_2: R29.2 ; port ESP_EN
NetR30_1: R30.1 ; port ESP_IO0
NetR31_2: R31.2 ; port ESP_TXD0
NetR32_2: R32.2 ; port ESP_RXD0
NetU7_11: U7.11(IO26) ; port PE_SCL
NetU7_12: U7.12(IO27) ; port PE_SDA
NetU7_13: U7.13(IO14) ; port PE_TX
NetU7_14: U7.14(IO12) ; port PE_RX
NetU7_26: U7.26(IO4) ; port SERVO_19
NetU7_27: U7.27(IO16) ; port SERVO_20
NetU7_28: U7.28(IO17) ; port SERVO_21
NetU7_29: U7.29(IO5) ; port SERVO_22
NetU7_30: U7.30(IO18) ; port SERVO_23
NetU7_31: U7.31(IO19) ; port SERVO_24

Not connected (* = marked no-connect by the designer): U7 4(SENSOR_VP)* 5(SENSOR_VN)* 6(IO34)* 7(IO35)* 8(IO32)* 9(IO33)* 10(IO25)* 16(IO13)* 17(NC)* 18(NC)* 19(NC)* 20(NC)* 21(NC)* 22(NC)* 23(IO15) 32(NC1)* 33(IO21)* 36(IO22)* 37(IO23)*

### Notes on the sheet
- (near R29) DNP
- (near R30) DNP

### Library data of the parts
C42 = N_P_CAP: as C28 on sheet MCU_STM; LCSC Part Number: C105883; Tolerance: *; MF: *; ESR: *; MPN: *
C43 C45 C46 = N_P_CAP: GENERIC NON-POLARIZED CAP; Tolerance: *; MF: *; ESR: *; MPN: *; Temperature Coefficient: *
  C43: LCSC Part Number: C354262
  C45: LCSC Part Number: C106858
  C46: LCSC Part Number: C106221
C44 = N_P_CAP: as C34 on sheet MCU_STM; LCSC Part Number: C90146; MF: *; ESR: *; Temperature Coefficient: *
J4 = PIN_HEADER_6P: GENERIC PIN HEADER 6P; MF: *; MPN: *; LCSC Part Number: *
R28 = RES: GENERIC RES; Power Rating: *; MPN: *; Rated Voltage: *; Temperature Coefficient: *; LCSC Part Number: C60490
R29-R32 = RES: as R63 on sheet Serial_Interface_I2C; Power Rating: *; Rated Voltage: *; Temperature Coefficient: *; LCSC Part Number: C105875
SW3 = TACTILE_SWITCH_NO_SPST_2P: GENERIC TACTILE SWITCH NO SPST 2P; MF: *; MPN: *; LCSC Part Number: *
TP11 = TEST_POINT: GENERIC TEST POINT; MF: *; MPN: *
U7 = ESP32-WROOM-32E_(4MB): Bluetooth, WiFi 802.11b/g/n, Bluetooth v4.2 +EDR, Class 1, 2 and 3 Transceiver Module 2.4GHz ~ 2.5GHz Integrated, Trace Surface Mount; MPN: ESP32-WROOM-32E (4MB); MF: Espressif Systems; Package: SMD-44 Espressif Systems
U8 = ESDALC6V1W5: as U6 on sheet MCU_STM; Package: SOT-323 STMicroelectronics; MPN: ESDALC6V1W5; LCSC Part Number: C703691

## Sheet IMU.SchDoc
size A; DocumentNumber: 9; SheetNumber: 9; SheetTotal: 14
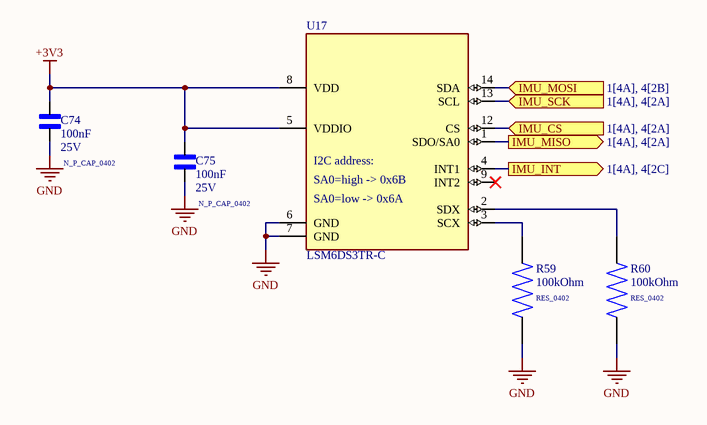
[diagram p8: IMU.SchDoc]

### Parts
C74  N_P_CAP_0402  value 100nF  Rated Voltage: 25V  [N_P_CAP_0402]
C75  N_P_CAP_0402  value 100nF  Rated Voltage: 25V  [N_P_CAP_0402]
R59  RES_0402  value 100kOhm  [RES_0402]
R60  RES_0402  value 100kOhm  [RES_0402]
U17  LSM6DS3TR-C  [LGA-14-2.5X3MM]

### Ports
IMU_CS (in, see 1[4A], 4[2A]), IMU_INT (out, see 1[4A], 4[2C]), IMU_MISO (out, see 1[4A], 4[2A]), IMU_MOSI (in, see 1[4A], 4[2B]), IMU_SCK (in, see 1[4A], 4[2A])

### Nets
+3V3: C74.2 C75.2 U17.5(VDDIO) U17.8(VDD)
GND: C74.1 C75.1 R59.2 R60.2 U17.6(GND) U17.7(GND)
NetR59_1: R59.1 U17.3(SCX)
NetR60_1: R60.1 U17.2(SDX)
NetU5_20: U17.12(CS) ; port IMU_CS
NetU5_21: U17.13(SCL) ; port IMU_SCK
NetU5_22: U17.1(SDO/SA0) ; port IMU_MISO
NetU5_23: U17.14(SDA) ; port IMU_MOSI
NetU5_24: U17.4(INT1) ; port IMU_INT

Not connected (* = marked no-connect by the designer): U17 9(INT2)*

### Notes on the sheet
- (in symbol LSM6DS3TR-C) I2C address:; SA0=high -> 0x6B; SA0=low -> 0x6A

### Library data of the parts
C74 C75 = N_P_CAP: as C28 on sheet MCU_STM; LCSC Part Number: C105883; Tolerance: *; MF: *; ESR: *; MPN: *
R59 R60 = RES: GENERIC RES; Tolerance: 1%; Power Rating: *; MPN: *; Rated Voltage: *; Temperature Coefficient: *; LCSC Part Number: C60491
U17 = LSM6DS3TR-C: IMUs - Inertial Measurement Units iNEMO 6DoF inertial module, for entry level / mid-tier smart phones and Portable PC platforms; MF: STMicroelectronics; MPN: LSM6DS3TR-C; LCSC Part Number: C967633

## Sheet Power_Input.SchDoc
size A; DocumentNumber: 1; SheetNumber: 2; SheetTotal: 14
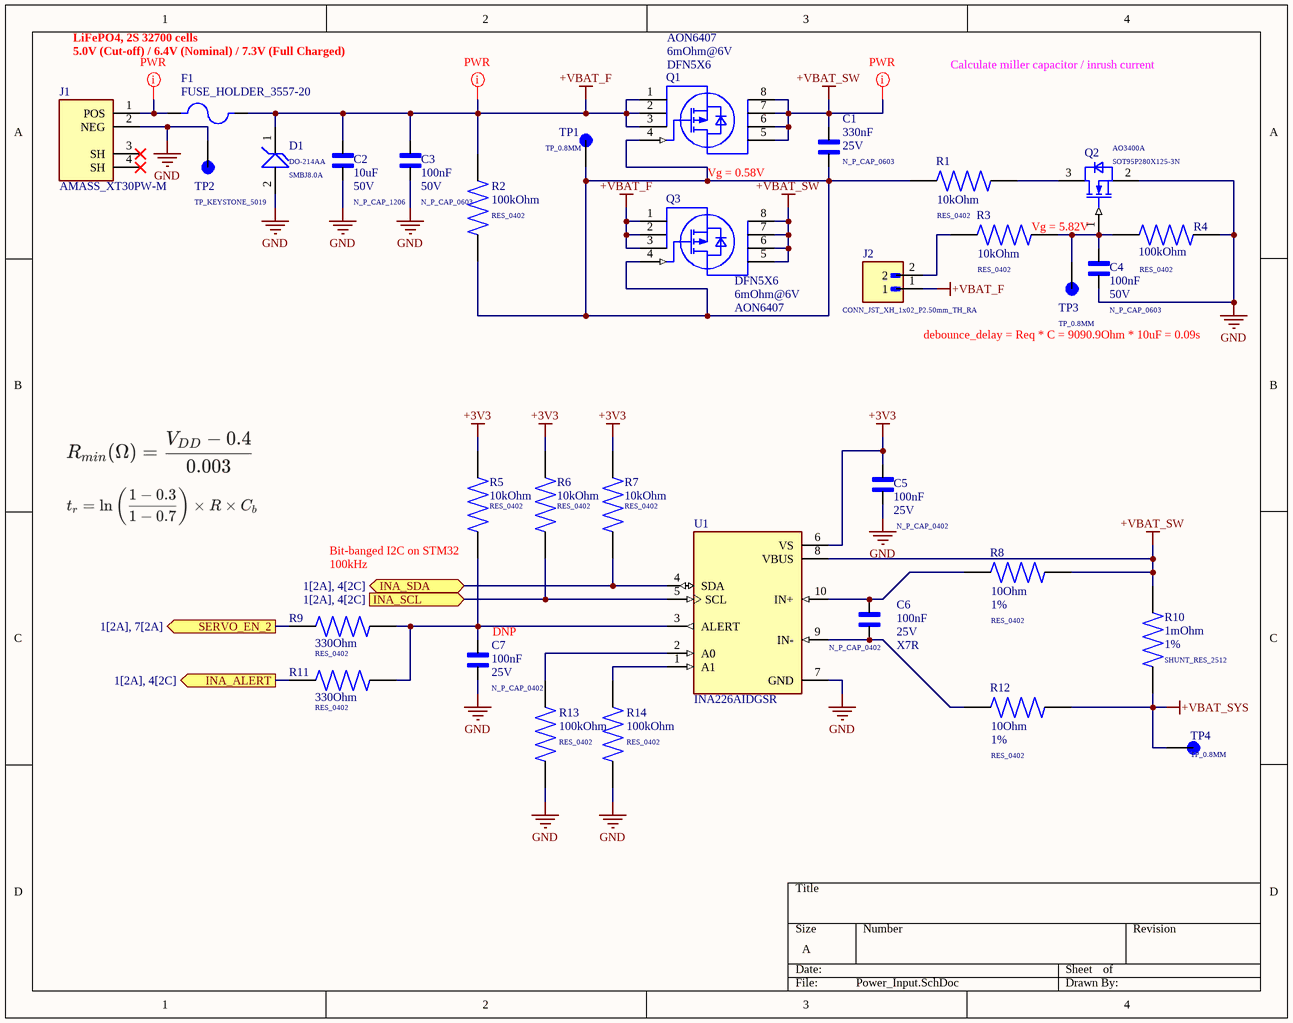
[diagram p9: Power_Input.SchDoc]

### Parts
C1  N_P_CAP_0603  value 330nF  Rated Voltage: 25V  [N_P_CAP_0603]
C2  N_P_CAP_1206  value 10uF  Rated Voltage: 50V  [N_P_CAP_1206]
C3  N_P_CAP_0603  value 100nF  Rated Voltage: 50V  [N_P_CAP_0603]
C4  N_P_CAP_0603  value 100nF  Rated Voltage: 50V  [N_P_CAP_0603]
C5  N_P_CAP_0402  value 100nF  Rated Voltage: 25V  [N_P_CAP_0402]
C6  N_P_CAP_0402  value 100nF  Temperature Coefficient: X7R  Rated Voltage: 25V  [N_P_CAP_0402]
C7  N_P_CAP_0402  value 100nF  Rated Voltage: 25V  [N_P_CAP_0402]
D1  DO-214AA  MPN: SMBJ8.0A  [DO-214AA]
F1  FUSE_HOLDER_3557-20  [FUSE_HOLDER_3557-20]
J1  AMASS_XT30PW-M  [AMASS_XT30PW-M]
J2  CONN_JST_XH_1x02_P2.50mm_TH_RA  [CONN_JST_XH_1x02_P2.50mm_TH_RA]
Q1  DFN5X6  Rds(on) (Max): 6mOhm@6V  MPN: AON6407  [DFN5X6]
Q2  SOT95P280X125-3N  MPN: AO3400A  [SOT95P280X125-3N]
Q3  DFN5X6  Rds(on) (Max): 6mOhm@6V  MPN: AON6407  [DFN5X6]
R1  RES_0402  value 10kOhm  [RES_0402]
R2  RES_0402  value 100kOhm  [RES_0402]
R3  RES_0402  value 10kOhm  [RES_0402]
R4  RES_0402  value 100kOhm  [RES_0402]
R5  RES_0402  value 10kOhm  [RES_0402]
R6  RES_0402  value 10kOhm  [RES_0402]
R7  RES_0402  value 10kOhm  [RES_0402]
R8  RES_0402  value 10Ohm  Tolerance: 1%  [RES_0402]
R9  RES_0402  value 330Ohm  [RES_0402]
R10  SHUNT_RES_2512  value 1mOhm  Tolerance: 1%  [SHUNT_RES_2512]
R11  RES_0402  value 330Ohm  [RES_0402]
R12  RES_0402  value 10Ohm  Tolerance: 1%  [RES_0402]
R13  RES_0402  value 100kOhm  [RES_0402]
R14  RES_0402  value 100kOhm  [RES_0402]
TP1  TP_0.8MM  [TP_0.8MM]
TP2  TP_KEYSTONE_5019  [TP_KEYSTONE_5019]
TP3  TP_0.8MM  [TP_0.8MM]
TP4  TP_0.8MM  [TP_0.8MM]
U1  INA226AIDGSR  [SOP50P490X110-10N]

### Ports
INA_ALERT (out, see 1[2A], 4[2C]), INA_SCL (in, see 1[2A], 4[2C]), INA_SDA (bidir, see 1[2A], 4[2C]), SERVO_EN_2 (out, see 1[2A], 7[2A])

### Nets
+3V3: C5.2 R5.2 R6.2 R7.2 U1.6(VS)
+VBAT_F: C2.2 C3.2 D1.1(K) F1.2 J2.1 Q1.1(SOURCE) Q1.2(SOURCE) Q1.3(SOURCE) Q3.1(SOURCE) Q3.2(SOURCE) Q3.3(SOURCE) R2.1
+VBAT_SW: C1.2 Q1.5(DRAIN) Q1.6(DRAIN) Q1.7(DRAIN) Q1.8(DRAIN) Q3.5(DRAIN) Q3.6(DRAIN) Q3.7(DRAIN) Q3.8(DRAIN) R8.2 R10.2 U1.8(VBUS)
+VBAT_SYS: R10.1 R12.2 TP4.TP
GND: C2.1 C3.1 C4.1 C5.1 C7.1 D1.2(A) J1.2(NEG) Q2.2(SOURCE) R4.2 R13.2 R14.2 TP2.TP U1.7(GND)
NetC1_1: C1.1 Q1.4(GATE) Q3.4(GATE) R1.1 R2.2 TP1.TP
NetC4_2: C4.2 Q2.1(GATE) R3.2 R4.1 TP3.TP
NetC6_1: C6.1 R12.1 U1.9(IN-)
NetC6_2: C6.2 R8.1 U1.10(IN+)
NetC7_2: C7.2 R5.1 R9.2 R11.1 U1.3(ALERT)
NetF1_1: F1.1 J1.1(POS)
NetJ2_2: J2.2 R3.1
NetQ2_3: Q2.3(DRAIN) R1.2
NetR6_1: R6.1 U1.5(SCL) ; port INA_SCL
NetR7_1: R7.1 U1.4(SDA) ; port INA_SDA
NetR9_1: R9.1 ; port SERVO_EN_2
NetR11_2: R11.2 ; port INA_ALERT
NetR13_1: R13.1 U1.2(A0)
NetR14_1: R14.1 U1.1(A1)

Not connected (* = marked no-connect by the designer): J1 3(SH)* 4(SH)*

### Layout directives
net class PWR: +VBAT_F, +VBAT_SW, NetF1_1

### Notes on the sheet
- LiFePO4, 2S 32700 cells
- 5.0V (Cut-off) / 6.4V (Nominal) / 7.3V (Full Charged)
- Calculate miller capacitor / inrush current
- Vg = 0.58V
- (near R3) Vg = 5.82V
- debounce_delay = Req * C = 9090.9Ohm * 10uF = 0.09s
- (near R5) Bit-banged I2C on STM32
- 100kHz
- (near C7) DNP

### Library data of the parts
C1-C4 C6 = N_P_CAP: GENERIC NON-POLARIZED CAP; Tolerance: *; MF: *; ESR: *; MPN: *
  C1: LCSC Part Number: C107070; Temperature Coefficient: *
  C2: LCSC Part Number: C100122; Temperature Coefficient: *
  C3 C4: LCSC Part Number: C106221; Temperature Coefficient: *
  C6: LCSC Part Number: C105883
C5 C7 = N_P_CAP: as C28 on sheet MCU_STM; LCSC Part Number: C105883; Tolerance: *; MF: *; ESR: *; MPN: *
D1 = TVS_DIODE_UNIDIRECTIONAL: GENERIC TVS DIODE UNIDIRECTIONAL; Polarity: Unidirectional; LCSC Part Number: C224028; Ipp (Max): *; Vc (Max): *; Vrwm: *; Vbr: *; MF: *; Direction Type: Unidirectional
F1 = FUSE: GENERIC FUSE; Rated Current: *; Rated Voltage: *; LCSC Part Number: C3205238; Response Time: *; Breaking Capacity: *; Fuse Type: *; MF: *; MPN: *
J1 = AMASS_PCB_CONNECTOR: GENERIC AMASS PCB CONNECTOR; MF: Amass; LCSC Part Number: C431092; MPN: *
J2 = CONN_2P: GENERIC CONNECTOR 2P; MF: *; MPN: *; LCSC Part Number: *
Q1 Q3 = PMOS_SOIC8: GENERIC P-MOSFET SOIC8; Vgs(th): 2.6V; Channel Type: P-Channel; LCSC Part Number: C13899; Vds (Max): *; Id (Max): *; MF: *
Q2 = NMOS_GSD: as Q8 on sheet Indicator; LCSC Part Number: C20917; Vds (Max): *; Id (Max): *; Vgs(th): *; MF: *; Rds(on) (Max): *
R1-R7 R13 R14 = RES: GENERIC RES; Tolerance: 1%; Power Rating: *; MPN: *; Rated Voltage: *; Temperature Coefficient: *
  R1 R3 R5-R7: LCSC Part Number: C60490
  R2 R4 R13 R14: LCSC Part Number: C60491
R8 R12 = RES: GENERIC RES; Power Rating: *; MPN: *; Rated Voltage: *; Temperature Coefficient: *; LCSC Part Number: C5455560
R9 R11 = RES: as R63 on sheet Serial_Interface_I2C; Power Rating: *; Rated Voltage: *; Temperature Coefficient: *; LCSC Part Number: C105875
R10 = SHUNT_RES: GENERIC SHUNT RES; MPN: EB25R001P6FGT; Power Rating: 6W; Rated Voltage: *; Temperature Coefficient: *; LCSC Part Number: C55591707
TP1-TP4 = TEST_POINT: GENERIC TEST POINT; MF: *; MPN: *
U1 = INA226AIDGSR: 36V, 16-bit, ultra-precise i2c output current/voltage/power monitor w/alert; MF: Texas Instruments; Package: VSSOP-10 Texas Instruments; MPN: INA226AIDGSR; LCSC Part Number: C49851

## Sheet Servo_Power.SchDoc
size A; DocumentNumber: 6; SheetNumber: 6; SheetTotal: 14
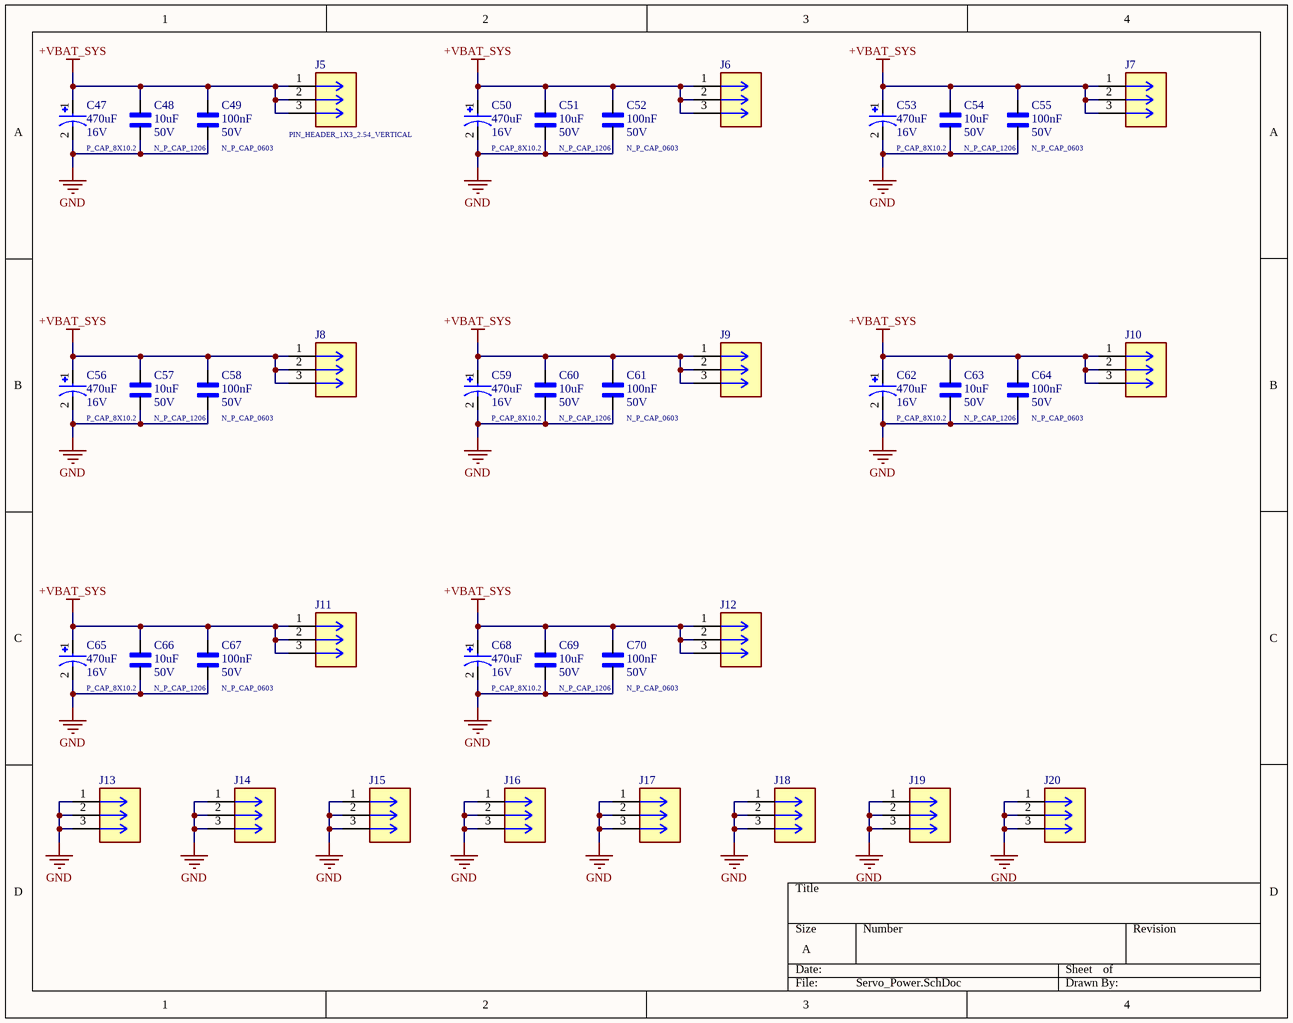
[diagram p10: Servo_Power.SchDoc]

### Parts
C47  P_CAP_8X10.2  value 470uF  Rated Voltage: 16V  [P_CAP_8X10.2]
C48  N_P_CAP_1206  value 10uF  Rated Voltage: 50V  [N_P_CAP_1206]
C49  N_P_CAP_0603  value 100nF  Rated Voltage: 50V  [N_P_CAP_0603]
C50  P_CAP_8X10.2  value 470uF  Rated Voltage: 16V  [P_CAP_8X10.2]
C51  N_P_CAP_1206  value 10uF  Rated Voltage: 50V  [N_P_CAP_1206]
C52  N_P_CAP_0603  value 100nF  Rated Voltage: 50V  [N_P_CAP_0603]
C53  P_CAP_8X10.2  value 470uF  Rated Voltage: 16V  [P_CAP_8X10.2]
C54  N_P_CAP_1206  value 10uF  Rated Voltage: 50V  [N_P_CAP_1206]
C55  N_P_CAP_0603  value 100nF  Rated Voltage: 50V  [N_P_CAP_0603]
C56  P_CAP_8X10.2  value 470uF  Rated Voltage: 16V  [P_CAP_8X10.2]
C57  N_P_CAP_1206  value 10uF  Rated Voltage: 50V  [N_P_CAP_1206]
C58  N_P_CAP_0603  value 100nF  Rated Voltage: 50V  [N_P_CAP_0603]
C59  P_CAP_8X10.2  value 470uF  Rated Voltage: 16V  [P_CAP_8X10.2]
C60  N_P_CAP_1206  value 10uF  Rated Voltage: 50V  [N_P_CAP_1206]
C61  N_P_CAP_0603  value 100nF  Rated Voltage: 50V  [N_P_CAP_0603]
C62  P_CAP_8X10.2  value 470uF  Rated Voltage: 16V  [P_CAP_8X10.2]
C63  N_P_CAP_1206  value 10uF  Rated Voltage: 50V  [N_P_CAP_1206]
C64  N_P_CAP_0603  value 100nF  Rated Voltage: 50V  [N_P_CAP_0603]
C65  P_CAP_8X10.2  value 470uF  Rated Voltage: 16V  [P_CAP_8X10.2]
C66  N_P_CAP_1206  value 10uF  Rated Voltage: 50V  [N_P_CAP_1206]
C67  N_P_CAP_0603  value 100nF  Rated Voltage: 50V  [N_P_CAP_0603]
C68  P_CAP_8X10.2  value 470uF  Rated Voltage: 16V  [P_CAP_8X10.2]
C69  N_P_CAP_1206  value 10uF  Rated Voltage: 50V  [N_P_CAP_1206]
C70  N_P_CAP_0603  value 100nF  Rated Voltage: 50V  [N_P_CAP_0603]
J5  PIN_HEADER_1X3_2.54_VERTICAL  [PIN_HEADER_1X3_2.54_VERTICAL]
J6  PIN_HEADER_1X3_2.54_VERTICAL  [PIN_HEADER_1X3_2.54_VERTICAL]  (value not drawn)
J7  PIN_HEADER_1X3_2.54_VERTICAL  [PIN_HEADER_1X3_2.54_VERTICAL]  (value not drawn)
J8  PIN_HEADER_1X3_2.54_VERTICAL  [PIN_HEADER_1X3_2.54_VERTICAL]  (value not drawn)
J9  PIN_HEADER_1X3_2.54_VERTICAL  [PIN_HEADER_1X3_2.54_VERTICAL]  (value not drawn)
J10  PIN_HEADER_1X3_2.54_VERTICAL  [PIN_HEADER_1X3_2.54_VERTICAL]  (value not drawn)
J11  PIN_HEADER_1X3_2.54_VERTICAL  [PIN_HEADER_1X3_2.54_VERTICAL]  (value not drawn)
J12  PIN_HEADER_1X3_2.54_VERTICAL  [PIN_HEADER_1X3_2.54_VERTICAL]  (value not drawn)
J13  PIN_HEADER_1X3_2.54_VERTICAL  [PIN_HEADER_1X3_2.54_VERTICAL]  (value not drawn)
J14  PIN_HEADER_1X3_2.54_VERTICAL  [PIN_HEADER_1X3_2.54_VERTICAL]  (value not drawn)
J15  PIN_HEADER_1X3_2.54_VERTICAL  [PIN_HEADER_1X3_2.54_VERTICAL]  (value not drawn)
J16  PIN_HEADER_1X3_2.54_VERTICAL  [PIN_HEADER_1X3_2.54_VERTICAL]  (value not drawn)
J17  PIN_HEADER_1X3_2.54_VERTICAL  [PIN_HEADER_1X3_2.54_VERTICAL]  (value not drawn)
J18  PIN_HEADER_1X3_2.54_VERTICAL  [PIN_HEADER_1X3_2.54_VERTICAL]  (value not drawn)
J19  PIN_HEADER_1X3_2.54_VERTICAL  [PIN_HEADER_1X3_2.54_VERTICAL]  (value not drawn)
J20  PIN_HEADER_1X3_2.54_VERTICAL  [PIN_HEADER_1X3_2.54_VERTICAL]  (value not drawn)

### Nets
+VBAT_SYS: C47.1(A) C48.2 C49.2 C50.1(A) C51.2 C52.2 C53.1(A) C54.2 C55.2 C56.1(A) C57.2 C58.2 C59.1(A) C60.2 C61.2 C62.1(A) C63.2 C64.2 C65.1(A) C66.2 C67.2 C68.1(A) C69.2 C70.2 J5.1 J5.2 J5.3 J6.1 J6.2 J6.3 J7.1 J7.2 J7.3 J8.1 J8.2 J8.3 J9.1 J9.2 J9.3 J10.1 J10.2 J10.3 J11.1 J11.2 J11.3 J12.1 J12.2 J12.3
GND: C47.2(K) C48.1 C49.1 C50.2(K) C51.1 C52.1 C53.2(K) C54.1 C55.1 C56.2(K) C57.1 C58.1 C59.2(K) C60.1 C61.1 C62.2(K) C63.1 C64.1 C65.2(K) C66.1 C67.1 C68.2(K) C69.1 C70.1 J13.1 J13.2 J13.3 J14.1 J14.2 J14.3 J15.1 J15.2 J15.3 J16.1 J16.2 J16.3 J17.1 J17.2 J17.3 J18.1 J18.2 J18.3 J19.1 J19.2 J19.3 J20.1 J20.2 J20.3

### Library data of the parts
C47 C50 C53 C56 C59 C62 C65 C68 = P_CAP: GENERIC POLARIZED CAP; MF: *; MPN: *; LCSC Part Number: C79121; Tolerance: *; ESR: *; Capacitor Type: *; Ripple Current: *
C48 C49 C51 C52 C54 C55 C57 C58 C60 C61 C63 C64 C66 C67 C69 C70 = N_P_CAP: GENERIC NON-POLARIZED CAP; Tolerance: *; MF: *; ESR: *; MPN: *; Temperature Coefficient: *
  C48 C51 C54 C57 C60 C63 C66 C69: LCSC Part Number: C100122
  C49 C52 C55 C58 C61 C64 C67 C70: LCSC Part Number: C106221
J5-J20 = PIN_HEADER_3P: GENERIC PIN HEADER 3P; MPN: 10129378-903001BLF; MF: Amphenol; LCSC Part Number: C5470076

## Sheet Power_Regulators.SchDoc
size A; DocumentNumber: 2; SheetNumber: 3; SheetTotal: 14
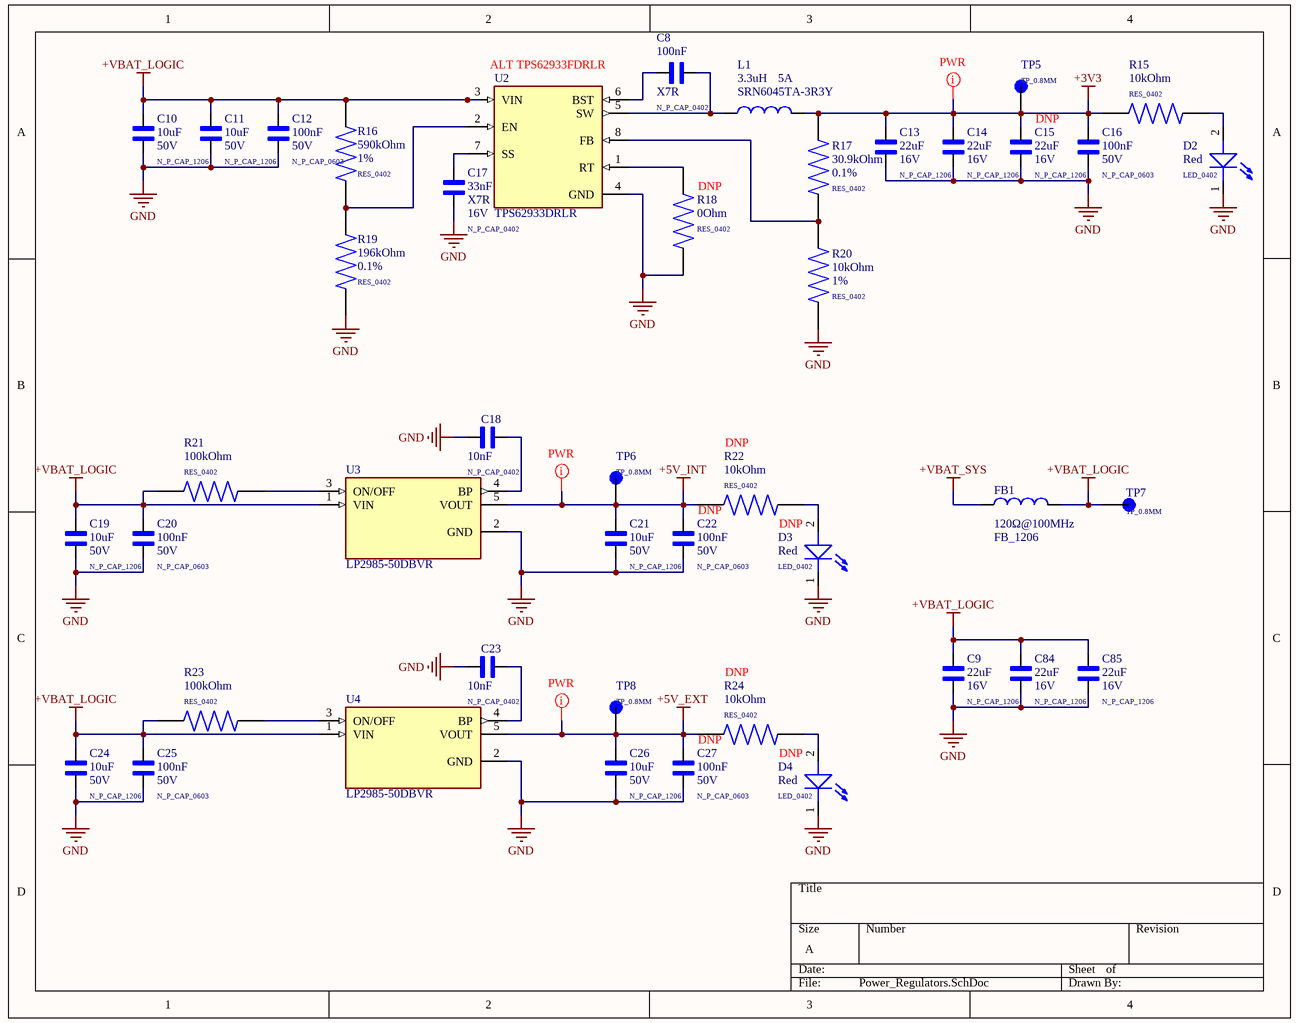
[diagram p11: Power_Regulators.SchDoc]

### Parts
C8  N_P_CAP_0402  value 100nF  Temperature Coefficient: X7R  [N_P_CAP_0402]
C9  N_P_CAP_1206  value 22uF  Rated Voltage: 16V  [N_P_CAP_1206]
C10  N_P_CAP_1206  value 10uF  Rated Voltage: 50V  [N_P_CAP_1206]
C11  N_P_CAP_1206  value 10uF  Rated Voltage: 50V  [N_P_CAP_1206]
C12  N_P_CAP_0603  value 100nF  Rated Voltage: 50V  [N_P_CAP_0603]
C13  N_P_CAP_1206  value 22uF  Rated Voltage: 16V  [N_P_CAP_1206]
C14  N_P_CAP_1206  value 22uF  Rated Voltage: 16V  [N_P_CAP_1206]
C15  N_P_CAP_1206  value 22uF  Rated Voltage: 16V  [N_P_CAP_1206]
C16  N_P_CAP_0603  value 100nF  Rated Voltage: 50V  [N_P_CAP_0603]
C17  N_P_CAP_0402  value 33nF  Temperature Coefficient: X7R  Rated Voltage: 16V  [N_P_CAP_0402]
C18  N_P_CAP_0402  value 10nF  [N_P_CAP_0402]
C19  N_P_CAP_1206  value 10uF  Rated Voltage: 50V  [N_P_CAP_1206]
C20  N_P_CAP_0603  value 100nF  Rated Voltage: 50V  [N_P_CAP_0603]
C21  N_P_CAP_1206  value 10uF  Rated Voltage: 50V  [N_P_CAP_1206]
C22  N_P_CAP_0603  value 100nF  Rated Voltage: 50V  [N_P_CAP_0603]
C23  N_P_CAP_0402  value 10nF  [N_P_CAP_0402]
C24  N_P_CAP_1206  value 10uF  Rated Voltage: 50V  [N_P_CAP_1206]
C25  N_P_CAP_0603  value 100nF  Rated Voltage: 50V  [N_P_CAP_0603]
C26  N_P_CAP_1206  value 10uF  Rated Voltage: 50V  [N_P_CAP_1206]
C27  N_P_CAP_0603  value 100nF  Rated Voltage: 50V  [N_P_CAP_0603]
C84  N_P_CAP_1206  value 22uF  Rated Voltage: 16V  [N_P_CAP_1206]
C85  N_P_CAP_1206  value 22uF  Rated Voltage: 16V  [N_P_CAP_1206]
D2  LED_0402  Color: Red  [LED_0402]
D3  LED_0402  Color: Red  [LED_0402]
D4  LED_0402  Color: Red  [LED_0402]
FB1  FB_1206  value 120Ω@100MHz  [FB_1206]
L1  value 3.3uH  MPN: SRN6045TA-3R3Y  Current Rating: 5A  [INDUCTOR_SRN6045TA-3R3Y]  (hidden comment: INDUCTOR_SRN6045TA-3R3Y)
R15  RES_0402  value 10kOhm  [RES_0402]
R16  RES_0402  value 590kOhm  Tolerance: 1%  [RES_0402]
R17  RES_0402  value 30.9kOhm  Tolerance: 0.1%  [RES_0402]
R18  RES_0402  value 0Ohm  [RES_0402]
R19  RES_0402  value 196kOhm  Tolerance: 0.1%  [RES_0402]
R20  RES_0402  value 10kOhm  Tolerance: 1%  [RES_0402]
R21  RES_0402  value 100kOhm  [RES_0402]
R22  RES_0402  value 10kOhm  [RES_0402]
R23  RES_0402  value 100kOhm  [RES_0402]
R24  RES_0402  value 10kOhm  [RES_0402]
TP5  TP_0.8MM  [TP_0.8MM]
TP6  TP_0.8MM  [TP_0.8MM]
TP7  TP_0.8MM  [TP_0.8MM]
TP8  TP_0.8MM  [TP_0.8MM]
U2  TPS62933DRLR  [SOTFL50P160X60-8N]
U3  LP2985-50DBVR  [SOT95P280X145-5N]
U4  LP2985-50DBVR  [SOT95P280X145-5N]

### Nets
+3V3: C13.2 C14.2 C15.2 C16.2 L1.2 R15.2 R17.2 TP5.TP
+5V_EXT: C26.2 C27.2 R24.2 TP8.TP U4.5(VOUT)
+5V_INT: C21.2 C22.2 R22.2 TP6.TP U3.5(VOUT)
+VBAT_LOGIC: C9.2 C10.2 C11.2 C12.2 C19.2 C20.2 C24.2 C25.2 C84.2 C85.2 FB1.2 R16.2 R21.1 R23.1 TP7.TP U2.3(VIN) U3.1(VIN) U4.1(VIN)
+VBAT_SYS: FB1.1
GND: C9.1 C10.1 C11.1 C12.1 C13.1 C14.1 C15.1 C16.1 C17.2 C18.1 C19.1 C20.1 C21.1 C22.1 C23.1 C24.1 C25.1 C26.1 C27.1 C84.1 C85.1 D2.1(K) D3.1(K) D4.1(K) R18.1 R19.1 R20.1 U2.4(GND) U3.2(GND) U4.2(GND)
NetC8_1: C8.1 L1.1 U2.5(SW)
NetC8_2: C8.2 U2.6(BST)
NetC17_1: C17.1 U2.7(SS)
NetC18_2: C18.2 U3.4(BP)
NetC23_2: C23.2 U4.4(BP)
NetD2_2: D2.2(A) R15.1
NetD3_2: D3.2(A) R22.1
NetD4_2: D4.2(A) R24.1
NetR16_1: R16.1 R19.2 U2.2(EN)
NetR17_1: R17.1 R20.2 U2.8(FB)
NetR18_2: R18.2 U2.1(RT)
NetR21_2: R21.2 U3.3(ON/OFF)
NetR23_2: R23.2 U4.3(ON/OFF)

### Layout directives
net class PWR: +3V3, +5V_EXT, +5V_INT

### Notes on the sheet
- (near U2) ALT TPS62933FDRLR
- DNP
- (near R18) DNP
- (near R22) DNP
- (near R24) DNP

### Library data of the parts
C8 = N_P_CAP: GENERIC NON-POLARIZED CAP; Rated Voltage: 25V; LCSC Part Number: C105883; Tolerance: *; MF: *; ESR: *; MPN: *
C9 C13-C15 C84 C85 = N_P_CAP: as C34 on sheet MCU_STM; LCSC Part Number: C90146; MF: *; ESR: *; Temperature Coefficient: *
C10-C12 C16 C17 C19-C22 C24-C27 = N_P_CAP: GENERIC NON-POLARIZED CAP; Tolerance: *; MF: *; ESR: *; MPN: *
  C10 C11 C19 C21 C24 C26: LCSC Part Number: C100122; Temperature Coefficient: *
  C12 C16 C20 C22 C25 C27: LCSC Part Number: C106221; Temperature Coefficient: *
  C17: LCSC Part Number: C723886
C18 C23 = N_P_CAP: GENERIC NON-POLARIZED CAP; Rated Voltage: 50V; LCSC Part Number: C60133; Tolerance: *; MF: *; ESR: *; MPN: *; Temperature Coefficient: *
D2-D4 = LED: GENERIC LED; MPN: *; Vf (Typ): *; Package: *; LCSC Part Number: C25503345; If (Max): *; MF: *
FB1 = FB: GENERIC FERRITE BEAD; MPN: BLM31KN121SN1L; DCR (Max): 9mOhm; Current Rating: 6A; LCSC Part Number: C337884; Idc (Max): *; Tolerance: *; MF: *
L1 = INDUCTOR: GENERIC INDUCTOR; MF: BOURNS; Isat: 7.8A; Tolerance: 30%; LCSC Part Number: *; Irms: *; DCR (Max): *
R15 R18 R21-R24 = RES: GENERIC RES; Tolerance: 1%; Power Rating: *; MPN: *; Rated Voltage: *; Temperature Coefficient: *
  R15 R22 R24: LCSC Part Number: C60490
  R18: LCSC Part Number: C106231
  R21 R23: LCSC Part Number: C60491
R16 R19 R20 = RES: GENERIC RES; Power Rating: *; MPN: *; Rated Voltage: *; Temperature Coefficient: *
  R16: LCSC Part Number: C477764
  R19: LCSC Part Number: C852585
  R20: LCSC Part Number: C60490
R17 = RES: GENERIC RES; MPN: RT0402BRD0730K9L; Power Rating: *; Rated Voltage: *; Temperature Coefficient: *; LCSC Part Number: C852715
TP5-TP8 = TEST_POINT: GENERIC TEST POINT; MF: *; MPN: *
U2 = TPS62933DRLR: 3.8-V to 30-V, 3-A, 200-kHz to 2.2-MHz, low-IQ synchronous buck converter in SOT-583 package; MF: Texas Instruments; Package: SOT-583 Texas Instruments; MPN: TPS62933DRLR; LCSC Part Number: C3200405
U3 U4 = LP2985-50DBVR: 150-mA, 16-V, low-dropout voltage regulator with enable; MF: Texas Instruments; Package: SOT-23-5 Texas Instruments; MPN: LP2985-50DBVR; LCSC Part Number: C74511